# Altium project ARU8113 Testboard.PrjPcb (part 1 of 2)
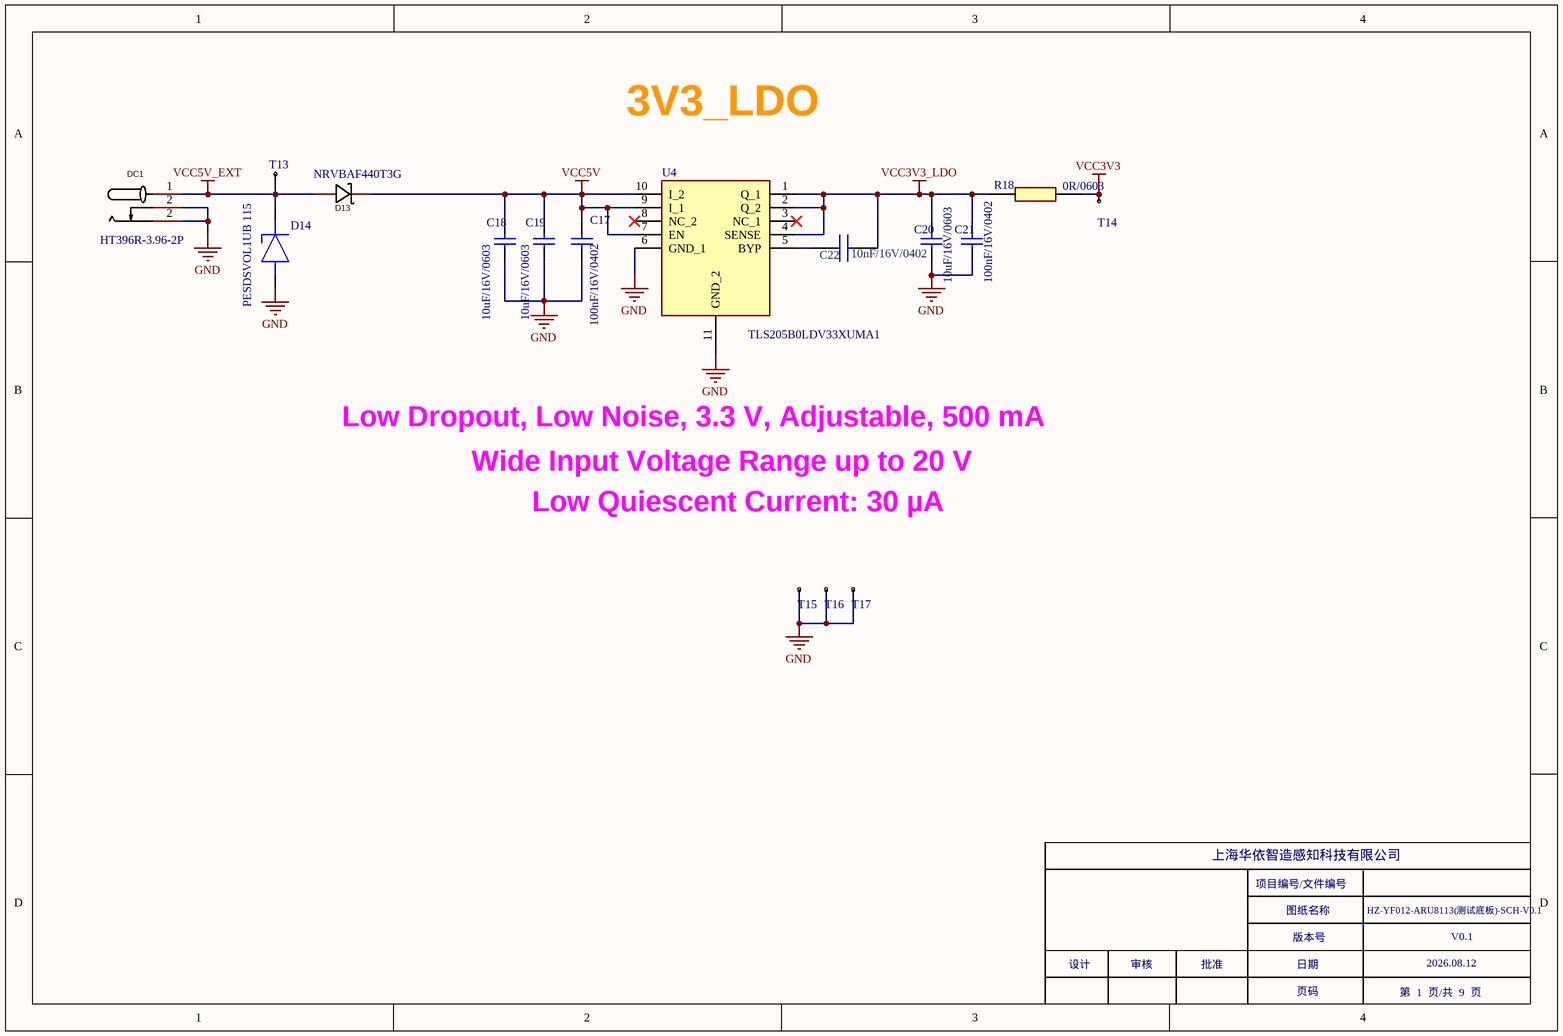
[diagram p0: 01_POWER .SchDoc]
9 sheets, 512 parts. Net scope: global (net labels, ports and power ports of the same name join across sheets).
Board files: ARU8113 Testboard_V0.1.PcbDoc, PCB2.PcbDoc
Sheets:
  01_POWER .SchDoc
  02_test1.SchDoc
  03_test2.SchDoc
  04_test3.SchDoc
  05_test4.SchDoc
  06_test5.SchDoc
  07_test6.SchDoc
  08_test7.SchDoc
  09_test8.SchDoc

## Sheet 01_POWER .SchDoc
size A4

### Parts
C17  100nF/16V/0402  [C 0402_L]
C18  10uF/16V/0603  [C 0603_L]
C19  10uF/16V/0603  [C 0603_L]
C20  10uF/16V/0603  [C 0603_L]
C21  100nF/16V/0402  [C 0402_L]
C22  10nF/16V/0402  [C 0402_L]
D13  NRVBAF440T3G  [SMA]
D14  PESDSVOL1UB 115  [SOD-523]
DC1  HT396R-3.96-2P  [HT396-3.96-2P]
R18  0R/0603  [R 0603_L]
T13  TEST  [TEST]  (value not drawn)
T14  TEST  [TEST]  (value not drawn)
T15  TEST  [TEST]  (value not drawn)
T16  TEST  [TEST]  (value not drawn)
T17  TEST  [TEST]  (value not drawn)
U4  TLS205B0LDV33XUMA1  [SON50P330X330X110-11N]

### Nets
GND: C17.2 C18.2 C19.2 C20.2 C21.2 D14.1 DC1.2 T15.1 T16.1 T17.1 U4.6(GND_1) U4.11(GND_2)
VCC3V3: R18.1 T14.1
VCC3V3_LDO: C20.1 C21.1 C22.1 R18.2 U4.1(Q_1) U4.2(Q_2) U4.4(SENSE)
VCC5V: C17.1 C18.1 C19.1 D13.2(K) U4.7(EN) U4.9(I_1) U4.10(I_2)
VCC5V_EXT: D13.1(A) D14.2 DC1.1 T13.1
NetC22_2: C22.2 U4.5(BYP)

Not connected (* = marked no-connect by the designer): U4 3(NC_1)* 8(NC_2)*

### Notes on the sheet
- 3V3_LDO
- Low Dropout, Low Noise, 3.3 V, Adjustable, 500 mA
- Wide Input Voltage Range up to 20 V
- Low Quiescent Current: 30 µA
- 上海华依智造感知科技有限公司
- 项目编号/文件编号
- 图纸名称
- HZ-YF012-ARU8113(测试底板)-SCH-V0.1
- 设计
- 审核
- 批准
- 版本号
- 日期
- 2026.08.12
- V0.1
- 页码
- 第  1  页/共  9  页

### Library data of the parts
C17 C21 = Cap: SMD/SMT 10UF 16V 20% 0603; Value: 10uF/16V; Published: 8-Jun-2000; LatestRevisionDate: 17-Jul-2002; LatestRevisionNote: Re-released for DXP Platform.; PackageReference: RAD-0.3; Publisher: Altium Limited; PackageDescription: Radial Cap, Thru-Hole; 2 Leads; 0.3 in Pin Spacing
C18-C20 = Cap: SMD/SMT 10UF 16V 20% 0603; Published: 8-Jun-2000; LatestRevisionDate: 17-Jul-2002; LatestRevisionNote: Re-released for DXP Platform.; PackageReference: RAD-0.3; Publisher: Altium Limited; PackageDescription: Radial Cap, Thru-Hole; 2 Leads; 0.3 in Pin Spacing; Value: 10uF/16V
C22 = 0402Capacitor: Capacitor; Manufacturer_Name: Murata Electronics; Manufacturer_Part_Number: GCM155R71C104KA55D; Datasheet Link: https://componentsearchengine.com//GCM155R71C104KA55D.pdf; Height: 0.55mm; Mouser2 Part Number: 81-GCM155R71C104KA5D; Mouser2 Price/Stock: https://www.mouser.com/Search/Refine.aspx?Keyword=81-GCM155R71C104KA5D
D13 = SS14_C2480: Manufacturer: MDD; Symbol: SS14; Add into BOM: yes; Diode Configuration: 独立式; Forward Voltage (Vf@If): 550mV@1A; Reverse Voltage (Vr): 40V; Average Rectified Current (Io): 1A; Reverse Leakage Current (Ir): 500uA@40V; Device: SS14_C2480; Supplier: LCSC; Manufacturer Part: SS14; Supplier Part: C2480; JLCPCB Part Class: Basic Part; LCSC Part Name: 电压:40V 电流:1A; Supplier Footprint: SMA(DO-214AC); Datasheet: https://atta.szlcsc.com/upload/public/pdf/source/20230712/2DB6064CFBB99DE6DB116BEE8208BE66.pdf; Convert to PCB: yes
D14 = PESD5V0L1UB,115: Diode ESD (Uni-directional); Manufacturer_Name: Nexperia; Datasheet Link: https://assets.nexperia.com/documents/data-sheet/PESD5V0L1UB.pdf; Height: 0.65mm; Manufacturer_Part_Number: PESD5V0L1UB,115
DC1 = DC005: Manufacturer: SHOU HAN(首韩); Symbol: DC005_C431533; Add into BOM: yes; Connector Type: DC电源插座; Inside Contact Diameter: 2mm; Outside Contact Diameter: 6.3mm; Current Rating (Max): 500mA; Voltage Rating (Max): 30V; Device: DC005; LCSC Part Name: DC电源插座 内径:2mm 外径:6.3mm; Supplier Part: C431533; Manufacturer Part: DC005; Supplier Footprint: 插件; JLCPCB Part Class: Extended Part; Datasheet: https://atta.szlcsc.com/upload/public/pdf/source/20190925/C431533_4751811035784AC1D38EBC85F7905E99.pdf; Supplier: LCSC; Convert to PCB: yes; Mounting Style: 弯插; Operating Temperature Range: -40℃~+55℃
R18 = 0402Resistor: Resistor; Manufacturer_Name: KOA Speer; Manufacturer_Part_Number: RN73H1ETTP1002F50; Datasheet Link: https://www.mouser.fr/datasheet/2/219/RN73H-12200.pdf; Height: 0.4mm
U4 = TLS205B0LDV33XUMA1: Integrated Circuit; Manufacturer_Name: Infineon; Datasheet Link: https://www.mouser.de/datasheet/2/196/Infineon-TLS203B0-DS-v01_20-EN-1149982.pdf; Height: 1.1mm; Manufacturer_Part_Number: TLS205B0LDV33XUMA1; ComponentLink1Description: New link; ComponentLink1URL: *

## Sheet 02_test1.SchDoc
size A3; SheetNumber: 1; SheetTotal: 1
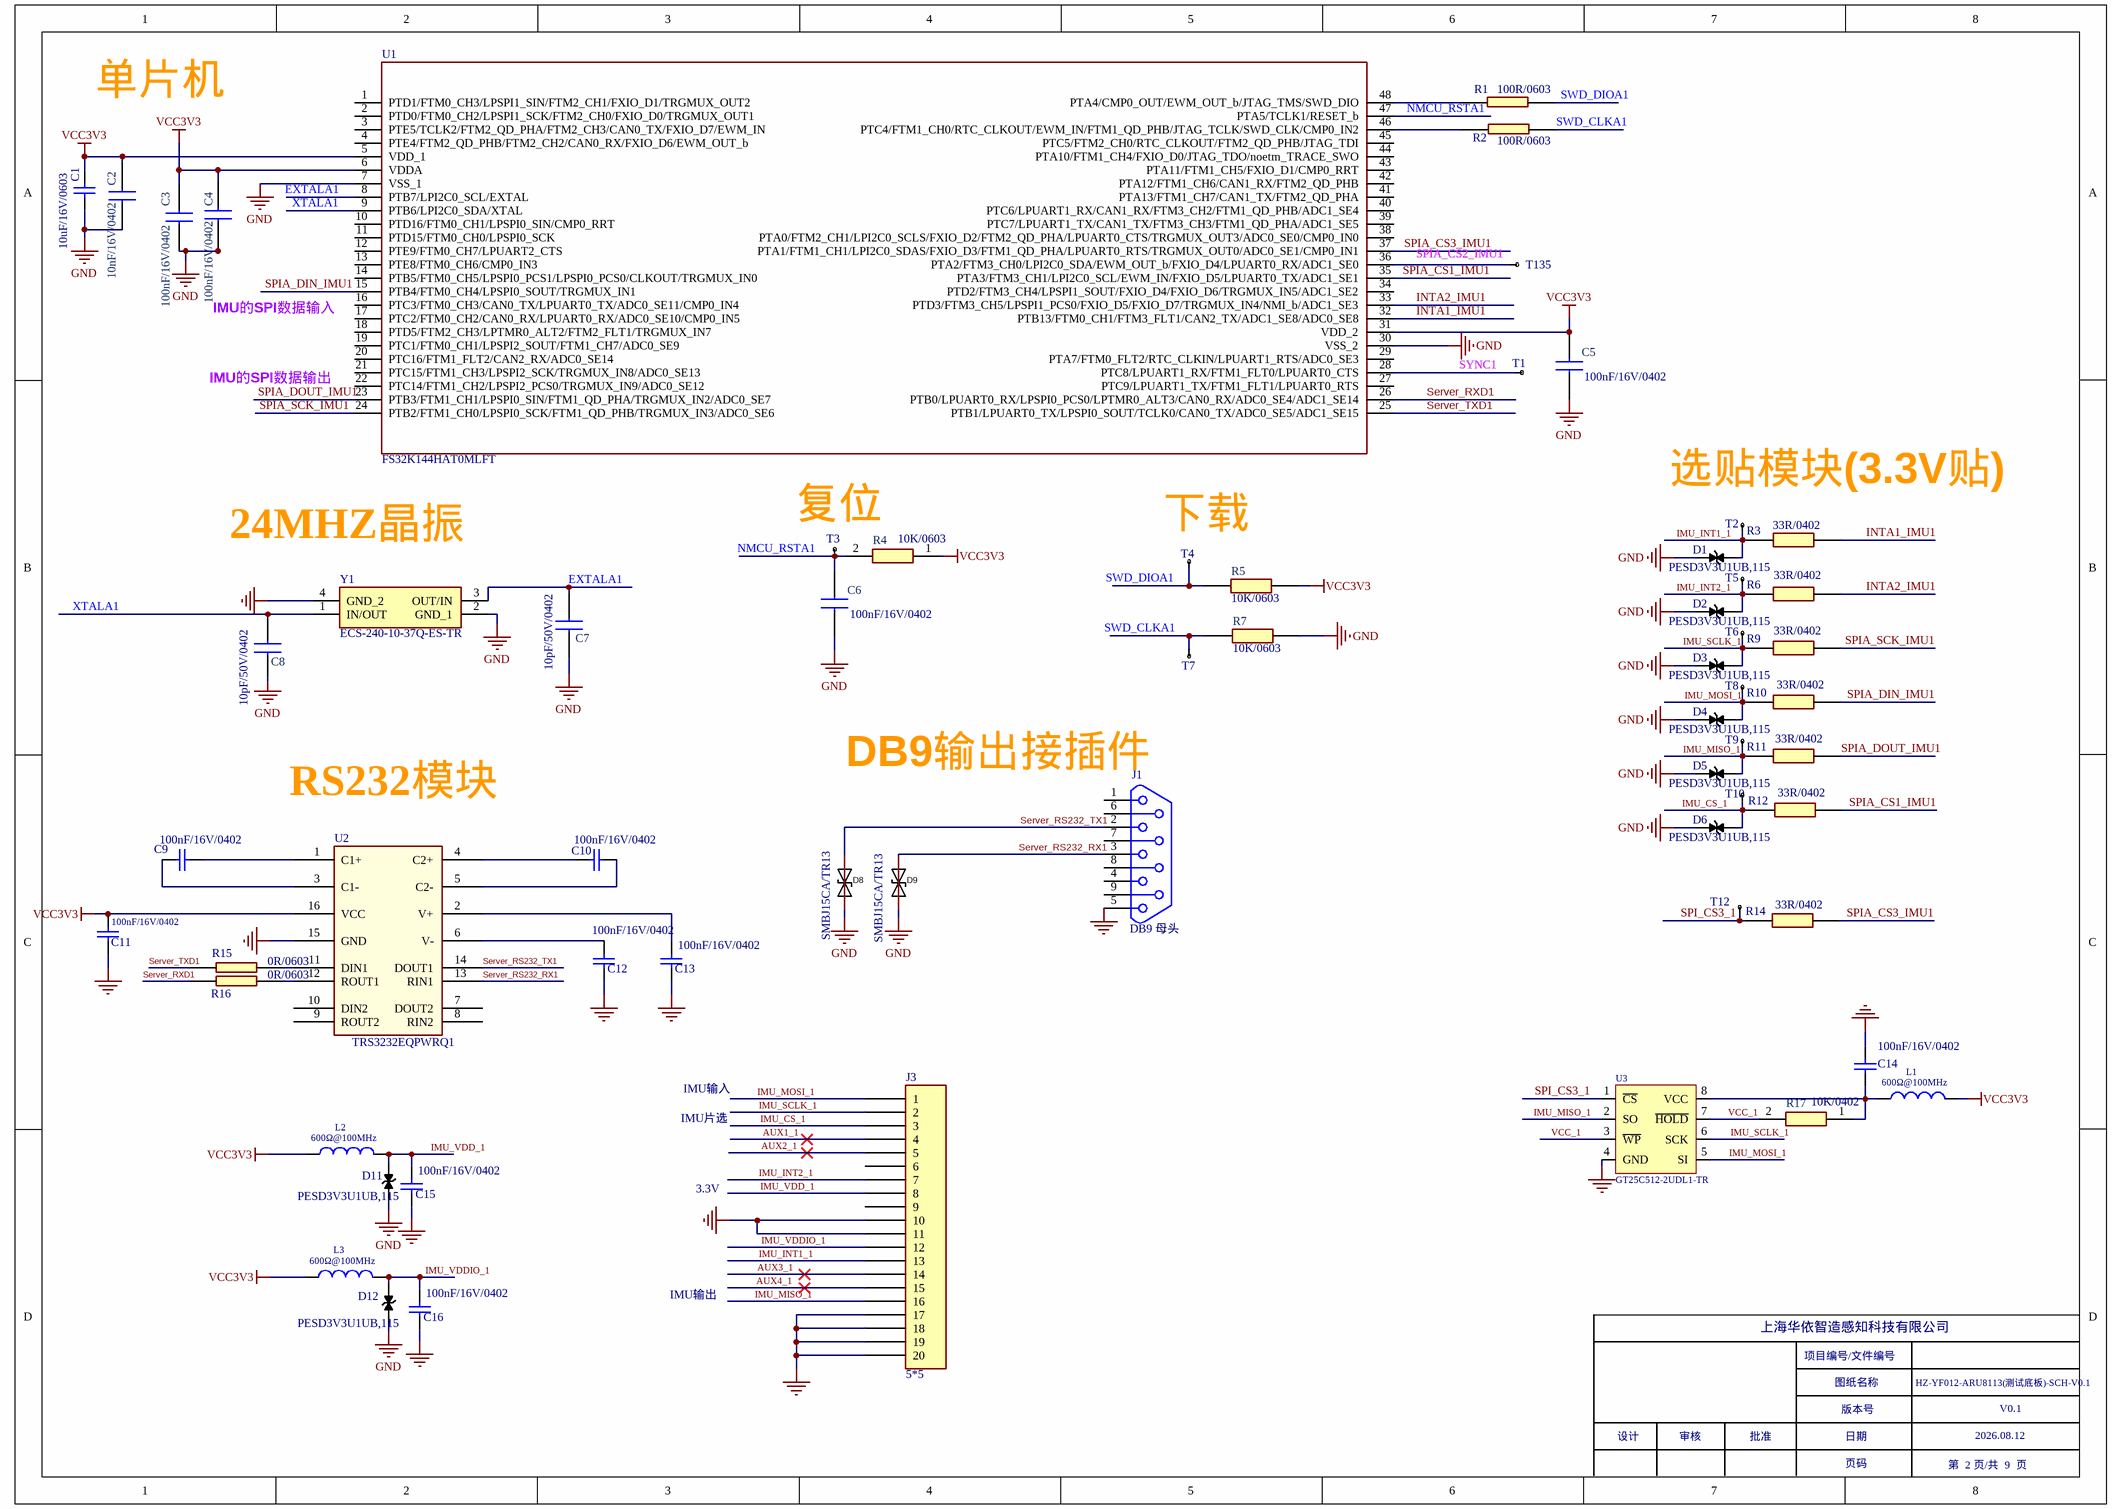
[diagram p1: 02_test1.SchDoc]

### Parts
C1  10uF/16V/0603  [C 0603_L]
C2  10nF/16V/0402  [C 0402_L]
C3  100nF/16V/0402  [C 0402_L]
C4  100nF/16V/0402  [C 0402_L]
C5  100nF/16V/0402  [C 0402_L]
C6  100nF/16V/0402  [C 0402_L]
C7  10pF/50V/0402  [C 0402_L]
C8  10pF/50V/0402  [C 0402_L]
C9  100nF/16V/0402  [C 0402_L]
C10  100nF/16V/0402  [C 0402_L]
C11  value 100nF/16V/0402  [C 0402_L]  (hidden comment: Cap)
C12  100nF/16V/0402  [C 0402_L]
C13  100nF/16V/0402  [C 0402_L]
C14  100nF/16V/0402  [C 0402_L]
C15  100nF/16V/0402  [C 0402_L]
C16  100nF/16V/0402  [0402C]
D1  PESD3V3U1UB,115  [SOD-523]
D2  PESD3V3U1UB,115  [SOD-523]
D3  PESD3V3U1UB,115  [SOD-523]
D4  PESD3V3U1UB,115  [SOD-523]
D5  PESD3V3U1UB,115  [SOD-523]
D6  PESD3V3U1UB,115  [SOD-523]
D8  SMBJ15CA/TR13  [SMB]
D9  SMBJ15CA/TR13  [SMB]
D11  PESD3V3U1UB,115  [PESD3V3U1UB,115]
D12  PESD3V3U1UB,115  [PESD3V3U1UB,115]
J1  DB9 母头  [DB9-RS8R1-2R77]
J3  5*5  [5*5-socket]
L1  value 600Ω@100MHz  [0603L]  (hidden comment: Inductor)
L2  value 600Ω@100MHz  [0603L]  (hidden comment: Inductor)
L3  value 600Ω@100MHz  [0603L]  (hidden comment: Inductor)
R1  100R/0603  [R 0603_L]
R2  100R/0603  [R 0603_L]
R3  33R/0402  [0402R]
R4  10K/0603  [R 0603_L]
R5  10K/0603  [R 0603_L]
R6  33R/0402  [0402R]
R7  10K/0603  [R 0603_L]
R9  33R/0402  [0402R]
R10  33R/0402  [0402R]
R11  33R/0402  [0402R]
R12  33R/0402  [0402R]
R14  33R/0402  [0402R]
R15  0R/0603  [R 0603_L]
R16  0R/0603  [R 0603_L]
R17  10K/0402  [0402R]
T1  TEST  [Test-0.5mm]  (value not drawn)
T2  TEST  [TEST]  (value not drawn)
T3  TEST  [TEST]  (value not drawn)
T4  TEST  [TEST]  (value not drawn)
T5  TEST  [TEST]  (value not drawn)
T6  TEST  [TEST]  (value not drawn)
T7  TEST  [TEST]  (value not drawn)
T8  TEST  [TEST]  (value not drawn)
T9  TEST  [TEST]  (value not drawn)
T10  TEST  [TEST]  (value not drawn)
T12  TEST  [Test-0.5mm]  (value not drawn)
T135  TEST  [Test-0.5mm]  (value not drawn)
U1  FS32K144HAT0MLFT  [LQFP48_7X7]
U2  TRS3232EQPWRQ1  [TSSOP16_640X500]
U3  GT25C512-2UDL1-TR  [GT25C512-2UDLA2-TR]
Y1  ECS-240-10-37Q-ES-TR  [ECS2401037QESTR]

### Nets
GND: C1.2 C2.1 C3.2 C4.2 C5.2 C6.2 C7.1 C8.1 C11.2 C12.2 C13.2 C14.1 C15.2 C16.2 D1.1 D2.1 D3.1 D4.1 D5.1 D6.1 D8.1 D9.1 D11.1 D12.1 J1.5 J3.10 J3.11 J3.17 J3.18 J3.19 J3.20 R7.1 U1.7(VSS_1) U1.30(VSS_2) U2.15(GND) U3.4(GND) Y1.2(GND_1) Y1.4(GND_2)
VCC3V3: C1.1 C2.2 C3.1 C4.1 C5.1 C11.1 L1.2 L2.1 L3.1 R4.1 R5.1 U1.5(VDD_1) U1.6(VDDA) U1.31(VDD_2) U2.16(VCC)
AUX1_1: J3.4
AUX2_1: J3.5
AUX3_1: J3.14
AUX4_1: J3.15
EXTALA1: C7.2 U1.8(PTB7/LPI2C0_SCL/EXTAL) Y1.3(OUT/IN)
IMU_CS_1: D6.2 J3.3 R12.2 T10.1
IMU_INT1_1: D1.2 J3.13 R3.2 T2.1
IMU_INT2_1: D2.2 J3.7 R6.2 T5.1
IMU_MISO_1: D5.2 J3.16 R11.2 T9.1 U3.2(SO)
IMU_MOSI_1: D4.2 J3.1 R10.2 T8.1 U3.5(SI)
IMU_SCLK_1: D3.2 J3.2 R9.2 T6.1 U3.6(SCK)
IMU_VDD_1: C15.1 D11.2 J3.8 L2.2
IMU_VDDIO_1: C16.1 D12.2 J3.12 L3.2
INTA1_IMU1: R3.1 U1.32(PTB13/FTM0_CH1/FTM3_FLT1/CAN2_TX/ADC1_SE8/ADC0_SE8)
INTA2_IMU1: R6.1 U1.33(PTD3/FTM3_CH5/LPSPI1_PCS0/FXIO_D5/FXIO_D7/TRGMUX_IN4/NMI_b/ADC1_SE3)
NMCU_RSTA1: C6.1 R4.2 T3.1 U1.47(PTA5/TCLK1/RESET_b)
Server_RS232_RX1: D9.2 J1.3 U2.13(RIN1)
Server_RS232_TX1: D8.2 J1.2 U2.14(DOUT1)
Server_RXD1: R16.1 U1.26(PTB0/LPUART0_RX/LPSPI0_PCS0/LPTMR0_ALT3/CAN0_RX/ADC0_SE4/ADC1_SE14)
Server_TXD1: R15.1 U1.25(PTB1/LPUART0_TX/LPSPI0_SOUT/TCLK0/CAN0_TX/ADC0_SE5/ADC1_SE15)
SPI_CS3_1: R14.2 T12.1 U3.1(~{CS})
SPIA_CS1_IMU1: R12.1 U1.35(PTA3/FTM3_CH1/LPI2C0_SCL/EWM_IN/FXIO_D5/LPUART0_TX/ADC1_SE1)
SPIA_CS3_IMU1: R14.1 U1.37(PTA1/FTM1_CH1/LPI2C0_SDAS/FXIO_D3/FTM1_QD_PHA/LPUART0_RTS/TRGMUX_OUT0/ADC0_SE1/CMP0_IN1)
SPIA_DIN_IMU1: R10.1 U1.15(PTB4/FTM0_CH4/LPSPI0_SOUT/TRGMUX_IN1)
SPIA_DOUT_IMU1: R11.1 U1.23(PTB3/FTM1_CH1/LPSPI0_SIN/FTM1_QD_PHA/TRGMUX_IN2/ADC0_SE7)
SPIA_SCK_IMU1: R9.1 U1.24(PTB2/FTM1_CH0/LPSPI0_SCK/FTM1_QD_PHB/TRGMUX_IN3/ADC0_SE6)
SWD_CLKA1: R2.2 R7.2 T7.1
SWD_DIOA1: R1.2 R5.2 T4.1
SYNC1: T1.1 U1.28(PTC8/LPUART1_RX/FTM1_FLT0/LPUART0_CTS)
VCC_1: R17.2 U3.3(~{WP}) U3.7(~{HOLD})
XTALA1: C8.2 U1.9(PTB6/LPI2C0_SDA/XTAL) Y1.1(IN/OUT)
NetC9_1: C9.1 U2.3(C1-)
NetC9_2: C9.2 U2.1(C1+)
NetC10_1: C10.1 U2.4(C2+)
NetC10_2: C10.2 U2.5(C2-)
NetC12_1: C12.1 U2.6(V-)
NetC13_1: C13.1 U2.2(V+)
NetC14_2: C14.2 L1.1 R17.1 U3.8(VCC)
NetR1_1: R1.1 U1.48(PTA4/CMP0_OUT/EWM_OUT_b/JTAG_TMS/SWD_DIO)
NetR2_1: R2.1 U1.46(PTC4/FTM1_CH0/RTC_CLKOUT/EWM_IN/FTM1_QD_PHB/JTAG_TCLK/SWD_CLK/CMP0_IN2)
NetR15_2: R15.2 U2.11(DIN1)
NetR16_2: R16.2 U2.12(ROUT1)
NetT135_1: T135.1 U1.36(PTA2/FTM3_CH0/LPI2C0_SDA/EWM_OUT_b/FXIO_D4/LPUART0_RX/ADC1_SE0)

Not connected (* = marked no-connect by the designer): J1 1 4 6 7 8 9; J3 6 9; U1 1(PTD1/FTM0_CH3/LPSPI1_SIN/FTM2_CH1/FXIO_D1/TRGMUX_OUT2) 2(PTD0/FTM0_CH2/LPSPI1_SCK/FTM2_CH0/FXIO_D0/TRGMUX_OUT1) 3(PTE5/TCLK2/FTM2_QD_PHA/FTM2_CH3/CAN0_TX/FXIO_D7/EWM_IN) 4(PTE4/FTM2_QD_PHB/FTM2_CH2/CAN0_RX/FXIO_D6/EWM_OUT_b) 10(PTD16/FTM0_CH1/LPSPI0_SIN/CMP0_RRT) 11(PTD15/FTM0_CH0/LPSPI0_SCK) 12(PTE9/FTM0_CH7/LPUART2_CTS) 13(PTE8/FTM0_CH6/CMP0_IN3) 14(PTB5/FTM0_CH5/LPSPI0_PCS1/LPSPI0_PCS0/CLKOUT/TRGMUX_IN0) 16(PTC3/FTM0_CH3/CAN0_TX/LPUART0_TX/ADC0_SE11/CMP0_IN4) 17(PTC2/FTM0_CH2/CAN0_RX/LPUART0_RX/ADC0_SE10/CMP0_IN5) 18(PTD5/FTM2_CH3/LPTMR0_ALT2/FTM2_FLT1/TRGMUX_IN7) 19(PTC1/FTM0_CH1/LPSPI2_SOUT/FTM1_CH7/ADC0_SE9) 20(PTC16/FTM1_FLT2/CAN2_RX/ADC0_SE14) 21(PTC15/FTM1_CH3/LPSPI2_SCK/TRGMUX_IN8/ADC0_SE13) 22(PTC14/FTM1_CH2/LPSPI2_PCS0/TRGMUX_IN9/ADC0_SE12) 27(PTC9/LPUART1_TX/FTM1_FLT1/LPUART0_RTS) 29(PTA7/FTM0_FLT2/RTC_CLKIN/LPUART1_RTS/ADC0_SE3) 34(PTD2/FTM3_CH4/LPSPI1_SOUT/FXIO_D4/FXIO_D6/TRGMUX_IN5/ADC1_SE2) 38(PTA0/FTM2_CH1/LPI2C0_SCLS/FXIO_D2/FTM2_QD_PHA/LPUART0_CTS/TRGMUX_OUT3/ADC0_SE0/CMP0_IN0) 39(PTC7/LPUART1_TX/CAN1_TX/FTM3_CH3/FTM1_QD_PHA/ADC1_SE5) 40(PTC6/LPUART1_RX/CAN1_RX/FTM3_CH2/FTM1_QD_PHB/ADC1_SE4) 41(PTA13/FTM1_CH7/CAN1_TX/FTM2_QD_PHA) 42(PTA12/FTM1_CH6/CAN1_RX/FTM2_QD_PHB) 43(PTA11/FTM1_CH5/FXIO_D1/CMP0_RRT) 44(PTA10/FTM1_CH4/FXIO_D0/JTAG_TDO/noetm_TRACE_SWO) 45(PTC5/FTM2_CH0/RTC_CLKOUT/FTM2_QD_PHB/JTAG_TDI); U2 7(DOUT2) 8(RIN2) 9(ROUT2) 10(DIN2)

### Notes on the sheet
- 单片机
- IMU的SPI数据输入
- IMU的SPI数据输出
- 选贴模块(3.3V贴)
- (near Y1) 24MHZ晶振
- (near T3) 复位
- (near T4) 下载
- DB9输出接插件
- (near U2) RS232模块
- IMU片选
- IMU输入
- 3.3V
- IMU输出
- 上海华依智造感知科技有限公司
- 项目编号/文件编号
- 图纸名称
- HZ-YF012-ARU8113(测试底板)-SCH-V0.1
- 设计
- 审核
- 批准
- 版本号
- 日期
- 2026.08.12
- V0.1
- 页码
- 第  2 页/共  9  页
- Labels drawn without touching a wire or pin: SPIA_CS2_IMU1

### Library data of the parts
C1 = Cap: SMD/SMT 10UF 16V 20% 0603; Published: 8-Jun-2000; LatestRevisionDate: 17-Jul-2002; LatestRevisionNote: Re-released for DXP Platform.; PackageReference: RAD-0.3; Publisher: Altium Limited; PackageDescription: Radial Cap, Thru-Hole; 2 Leads; 0.3 in Pin Spacing; Value: 10uF/16V
C2-C8 = 0402Capacitor: as C22 on sheet 01_POWER ; Datasheet Link: https://componentsearchengine.com//GCM155R71C104KA55D.pdf; Height: 0.55mm; Mouser2 Part Number: 81-GCM155R71C104KA5D; Mouser2 Price/Stock: https://www.mouser.com/Search/Refine.aspx?Keyword=81-GCM155R71C104KA5D
C9-C16 = Cap: '100nF/16V/10%/ 0402/X7R / -55℃ ～ 125℃/AEC-Q200; Published: 8-Jun-2000; LatestRevisionDate: 17-Jul-2002; LatestRevisionNote: Re-released for DXP Platform.; PackageReference: RAD-0.3; Publisher: Altium Limited; PackageDescription: Radial Cap, Thru-Hole; 2 Leads; 0.3 in Pin Spacing
  C9 C10 C12-C16: Value: 100nF/16V/0402
D1-D6 D11 D12 = SMBJ36CA: 双向TVS管；600W表面贴装瞬态电压抑制器,工作电压36V，SMB_DO-214AA封装 DIODES
D8 D9 = SMBJ15CA/TR13_C78410: Manufacturer: Brightking(君耀电子); Symbol: SMBJ15CA-C78410; Add into BOM: yes; polarity: 双向; Reverse Stand-Off Voltage (Vrwm): 15V; Maximum Clamping Voltage: 24.4V; Peak Pulse Current (Ipp)@10/1000us: 24.6A; Peak Pulse Power Dissipation (Ppp)@10/1000us: 600W; Breakdown Voltage: 16.7V; Type: TVS; Device: SMBJ15CA/TR13_C78410; LCSC Part Name: 双向 15V截止 24.6A峰值脉冲; Supplier Part: C78410; Manufacturer Part: SMBJ15CA/TR13; Supplier Footprint: SMB(DO-214AA); JLCPCB Part Class: Extended Part; Datasheet: https://atta.szlcsc.com/upload/public/pdf/source/20181127/C309995_EB3DFB9F9AEE5D2146ECD9FA5992A402.pdf; Supplier: LCSC; Convert to PCB: yes
J1 = DB9
L1-L3 = Inductor: Code_IEC: 1005; Published: 8-Jun-2000; LatestRevisionDate: 29-May-2009; LatestRevisionNote: IPC-7351 Footprint Added.; PackageReference: 0402-A; Publisher: Altium Limited; PackageDescription: Chip Inductor; Code_JEITA: 0402
R1 R2 R15 R16 = 0402
R3-R7 R9-R12 R14 R17 = 0402Resistor: as R18 on sheet 01_POWER ; Datasheet Link: https://www.mouser.fr/datasheet/2/219/RN73H-12200.pdf; Height: 0.4mm
U1 = FS32K144HAT0MLFT: Integrated Circuit; Manufacturer_Name: NXP; Datasheet Link: http://www.nxp.com/docs/en/data-sheet/S32K-DS.pdf; Height: 1.6mm; Manufacturer_Part_Number: FS32K144HAT0MLFT
U3 = GT25C512-2UDLA2-TR
Y1 = ECS-240-10-37Q-ES-TR: Crystal or Oscillator; Manufacturer_Name: ECS; Datasheet Link: https://www.ecsxtal.com/store/pdf/ECX-1637Q.pdf; Height: 0.55mm; Manufacturer_Part_Number: ECS-240-10-37Q-ES-TR

## Sheet 03_test2.SchDoc
size A3
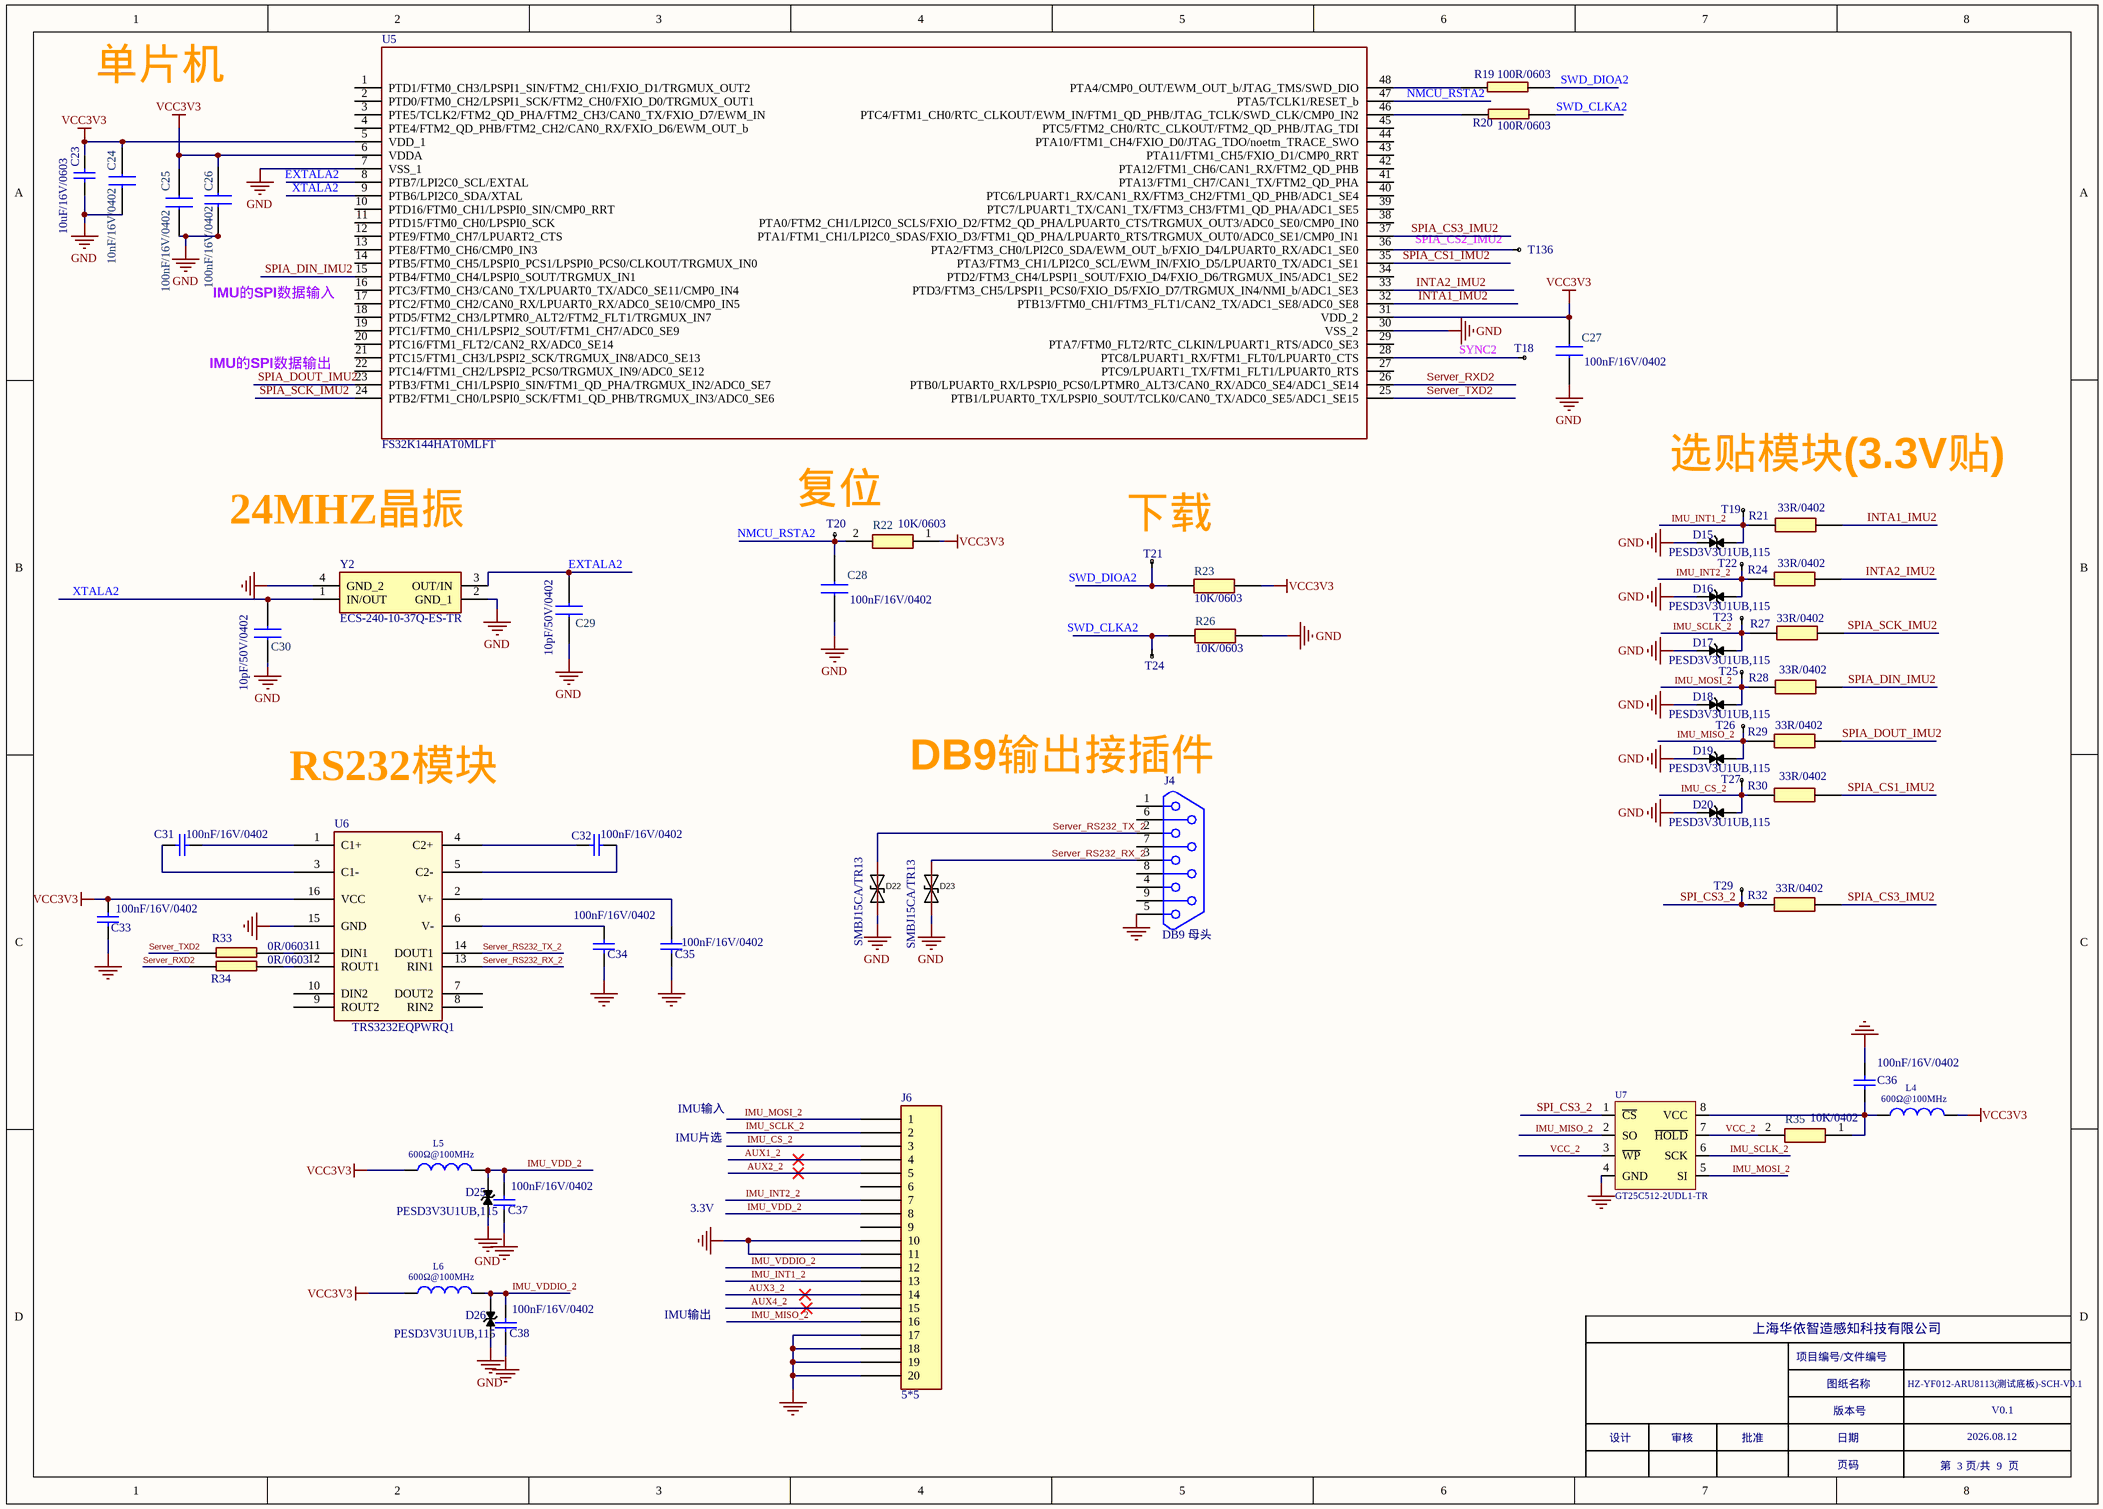
[diagram p2: 03_test2.SchDoc]

### Parts
C23  10uF/16V/0603  [C 0603_L]
C24  10nF/16V/0402  [C 0402_L]
C25  100nF/16V/0402  [C 0402_L]
C26  100nF/16V/0402  [C 0402_L]
C27  100nF/16V/0402  [C 0402_L]
C28  100nF/16V/0402  [C 0402_L]
C29  10pF/50V/0402  [C 0402_L]
C30  10pF/50V/0402  [C 0402_L]
C31  100nF/16V/0402  [C 0402_L]
C32  100nF/16V/0402  [C 0402_L]
C33  100nF/16V/0402  [C 0402_L]
C34  100nF/16V/0402  [C 0402_L]
C35  100nF/16V/0402  [C 0402_L]
C36  100nF/16V/0402  [0402C]
C37  100nF/16V/0402  [0402C]
C38  100nF/16V/0402  [C 0402_L]
D15  PESD3V3U1UB,115  [SOD-523]
D16  PESD3V3U1UB,115  [SOD-523]
D17  PESD3V3U1UB,115  [SOD-523]
D18  PESD3V3U1UB,115  [SOD-523]
D19  PESD3V3U1UB,115  [SOD-523]
D20  PESD3V3U1UB,115  [SOD-523]
D22  SMBJ15CA/TR13  [SMB]
D23  SMBJ15CA/TR13  [SMB]
D25  PESD3V3U1UB,115  [PESD3V3U1UB,115]
D26  PESD3V3U1UB,115  [PESD3V3U1UB,115]
J4  DB9 母头  [DB9-RS8R1-2R77]
J6  5*5  [5*5-socket]
L4  value 600Ω@100MHz  [0603L]  (hidden comment: Inductor)
L5  value 600Ω@100MHz  [0603L]  (hidden comment: Inductor)
L6  value 600Ω@100MHz  [0603L]  (hidden comment: Inductor)
R19  100R/0603  [R 0603_L]
R20  100R/0603  [R 0603_L]
R21  33R/0402  [0402R]
R22  10K/0603  [R 0603_L]
R23  10K/0603  [R 0603_L]
R24  33R/0402  [0402R]
R26  10K/0603  [0603R]
R27  33R/0402  [0402R]
R28  33R/0402  [0402R]
R29  33R/0402  [0402R]
R30  33R/0402  [0402R]
R32  33R/0402  [0402R]
R33  0R/0603  [R 0603_L]
R34  0R/0603  [R 0603_L]
R35  10K/0402  [0402R]
T18  TEST  [Test-0.5mm]  (value not drawn)
T19  TEST  [TEST]  (value not drawn)
T20  TEST  [TEST]  (value not drawn)
T21  TEST  [TEST]  (value not drawn)
T22  TEST  [TEST]  (value not drawn)
T23  TEST  [TEST]  (value not drawn)
T24  TEST  [TEST]  (value not drawn)
T25  TEST  [TEST]  (value not drawn)
T26  TEST  [TEST]  (value not drawn)
T27  TEST  [TEST]  (value not drawn)
T29  TEST  [Test-0.5mm]  (value not drawn)
T136  TEST  [Test-0.5mm]  (value not drawn)
U5  FS32K144HAT0MLFT  [LQFP48_7X7]
U6  TRS3232EQPWRQ1  [TSSOP16_640X500]
U7  GT25C512-2UDL1-TR  [GT25C512-2UDLA2-TR]
Y2  ECS-240-10-37Q-ES-TR  [ECS2401037QESTR]

### Nets
GND: C23.2 C24.1 C25.2 C26.2 C27.2 C28.2 C29.1 C30.1 C33.2 C34.2 C35.2 C36.1 C37.2 C38.2 D15.1 D16.1 D17.1 D18.1 D19.1 D20.1 D22.1 D23.1 D25.1 D26.1 J4.5 J6.10 J6.11 J6.17 J6.18 J6.19 J6.20 R26.1 U5.7(VSS_1) U5.30(VSS_2) U6.15(GND) U7.4(GND) Y2.2(GND_1) Y2.4(GND_2)
VCC3V3: C23.1 C24.2 C25.1 C26.1 C27.1 C33.1 L4.2 L5.1 L6.1 R22.1 R23.1 U5.5(VDD_1) U5.6(VDDA) U5.31(VDD_2) U6.16(VCC)
AUX1_2: J6.4
AUX2_2: J6.5
AUX3_2: J6.14
AUX4_2: J6.15
EXTALA2: C29.2 U5.8(PTB7/LPI2C0_SCL/EXTAL) Y2.3(OUT/IN)
IMU_CS_2: D20.2 J6.3 R30.2 T27.1
IMU_INT1_2: D15.2 J6.13 R21.2 T19.1
IMU_INT2_2: D16.2 J6.7 R24.2 T22.1
IMU_MISO_2: D19.2 J6.16 R29.2 T26.1 U7.2(SO)
IMU_MOSI_2: D18.2 J6.1 R28.2 T25.1 U7.5(SI)
IMU_SCLK_2: D17.2 J6.2 R27.2 T23.1 U7.6(SCK)
IMU_VDD_2: C37.1 D25.2 J6.8 L5.2
IMU_VDDIO_2: C38.1 D26.2 J6.12 L6.2
INTA1_IMU2: R21.1 U5.32(PTB13/FTM0_CH1/FTM3_FLT1/CAN2_TX/ADC1_SE8/ADC0_SE8)
INTA2_IMU2: R24.1 U5.33(PTD3/FTM3_CH5/LPSPI1_PCS0/FXIO_D5/FXIO_D7/TRGMUX_IN4/NMI_b/ADC1_SE3)
NMCU_RSTA2: C28.1 R22.2 T20.1 U5.47(PTA5/TCLK1/RESET_b)
Server_RS232_RX_2: D23.2 J4.3 U6.13(RIN1)
Server_RS232_TX_2: D22.2 J4.2 U6.14(DOUT1)
Server_RXD2: R34.1 U5.26(PTB0/LPUART0_RX/LPSPI0_PCS0/LPTMR0_ALT3/CAN0_RX/ADC0_SE4/ADC1_SE14)
Server_TXD2: R33.1 U5.25(PTB1/LPUART0_TX/LPSPI0_SOUT/TCLK0/CAN0_TX/ADC0_SE5/ADC1_SE15)
SPI_CS3_2: R32.2 T29.1 U7.1(~{CS})
SPIA_CS1_IMU2: R30.1 U5.35(PTA3/FTM3_CH1/LPI2C0_SCL/EWM_IN/FXIO_D5/LPUART0_TX/ADC1_SE1)
SPIA_CS3_IMU2: R32.1 U5.37(PTA1/FTM1_CH1/LPI2C0_SDAS/FXIO_D3/FTM1_QD_PHA/LPUART0_RTS/TRGMUX_OUT0/ADC0_SE1/CMP0_IN1)
SPIA_DIN_IMU2: R28.1 U5.15(PTB4/FTM0_CH4/LPSPI0_SOUT/TRGMUX_IN1)
SPIA_DOUT_IMU2: R29.1 U5.23(PTB3/FTM1_CH1/LPSPI0_SIN/FTM1_QD_PHA/TRGMUX_IN2/ADC0_SE7)
SPIA_SCK_IMU2: R27.1 U5.24(PTB2/FTM1_CH0/LPSPI0_SCK/FTM1_QD_PHB/TRGMUX_IN3/ADC0_SE6)
SWD_CLKA2: R20.2 R26.2 T24.1
SWD_DIOA2: R19.2 R23.2 T21.1
SYNC2: T18.1 U5.28(PTC8/LPUART1_RX/FTM1_FLT0/LPUART0_CTS)
VCC_2: R35.2 U7.3(~{WP}) U7.7(~{HOLD})
XTALA2: C30.2 U5.9(PTB6/LPI2C0_SDA/XTAL) Y2.1(IN/OUT)
NetC31_1: C31.1 U6.3(C1-)
NetC31_2: C31.2 U6.1(C1+)
NetC32_1: C32.1 U6.4(C2+)
NetC32_2: C32.2 U6.5(C2-)
NetC34_1: C34.1 U6.6(V-)
NetC35_1: C35.1 U6.2(V+)
NetC36_2: C36.2 L4.1 R35.1 U7.8(VCC)
NetR19_1: R19.1 U5.48(PTA4/CMP0_OUT/EWM_OUT_b/JTAG_TMS/SWD_DIO)
NetR20_1: R20.1 U5.46(PTC4/FTM1_CH0/RTC_CLKOUT/EWM_IN/FTM1_QD_PHB/JTAG_TCLK/SWD_CLK/CMP0_IN2)
NetR33_2: R33.2 U6.11(DIN1)
NetR34_2: R34.2 U6.12(ROUT1)
NetT136_1: T136.1 U5.36(PTA2/FTM3_CH0/LPI2C0_SDA/EWM_OUT_b/FXIO_D4/LPUART0_RX/ADC1_SE0)

Not connected (* = marked no-connect by the designer): J4 1 4 6 7 8 9; J6 6 9; U5 1(PTD1/FTM0_CH3/LPSPI1_SIN/FTM2_CH1/FXIO_D1/TRGMUX_OUT2) 2(PTD0/FTM0_CH2/LPSPI1_SCK/FTM2_CH0/FXIO_D0/TRGMUX_OUT1) 3(PTE5/TCLK2/FTM2_QD_PHA/FTM2_CH3/CAN0_TX/FXIO_D7/EWM_IN) 4(PTE4/FTM2_QD_PHB/FTM2_CH2/CAN0_RX/FXIO_D6/EWM_OUT_b) 10(PTD16/FTM0_CH1/LPSPI0_SIN/CMP0_RRT) 11(PTD15/FTM0_CH0/LPSPI0_SCK) 12(PTE9/FTM0_CH7/LPUART2_CTS) 13(PTE8/FTM0_CH6/CMP0_IN3) 14(PTB5/FTM0_CH5/LPSPI0_PCS1/LPSPI0_PCS0/CLKOUT/TRGMUX_IN0) 16(PTC3/FTM0_CH3/CAN0_TX/LPUART0_TX/ADC0_SE11/CMP0_IN4) 17(PTC2/FTM0_CH2/CAN0_RX/LPUART0_RX/ADC0_SE10/CMP0_IN5) 18(PTD5/FTM2_CH3/LPTMR0_ALT2/FTM2_FLT1/TRGMUX_IN7) 19(PTC1/FTM0_CH1/LPSPI2_SOUT/FTM1_CH7/ADC0_SE9) 20(PTC16/FTM1_FLT2/CAN2_RX/ADC0_SE14) 21(PTC15/FTM1_CH3/LPSPI2_SCK/TRGMUX_IN8/ADC0_SE13) 22(PTC14/FTM1_CH2/LPSPI2_PCS0/TRGMUX_IN9/ADC0_SE12) 27(PTC9/LPUART1_TX/FTM1_FLT1/LPUART0_RTS) 29(PTA7/FTM0_FLT2/RTC_CLKIN/LPUART1_RTS/ADC0_SE3) 34(PTD2/FTM3_CH4/LPSPI1_SOUT/FXIO_D4/FXIO_D6/TRGMUX_IN5/ADC1_SE2) 38(PTA0/FTM2_CH1/LPI2C0_SCLS/FXIO_D2/FTM2_QD_PHA/LPUART0_CTS/TRGMUX_OUT3/ADC0_SE0/CMP0_IN0) 39(PTC7/LPUART1_TX/CAN1_TX/FTM3_CH3/FTM1_QD_PHA/ADC1_SE5) 40(PTC6/LPUART1_RX/CAN1_RX/FTM3_CH2/FTM1_QD_PHB/ADC1_SE4) 41(PTA13/FTM1_CH7/CAN1_TX/FTM2_QD_PHA) 42(PTA12/FTM1_CH6/CAN1_RX/FTM2_QD_PHB) 43(PTA11/FTM1_CH5/FXIO_D1/CMP0_RRT) 44(PTA10/FTM1_CH4/FXIO_D0/JTAG_TDO/noetm_TRACE_SWO) 45(PTC5/FTM2_CH0/RTC_CLKOUT/FTM2_QD_PHB/JTAG_TDI); U6 7(DOUT2) 8(RIN2) 9(ROUT2) 10(DIN2)

### Notes on the sheet
- 单片机
- IMU的SPI数据输入
- IMU的SPI数据输出
- (near T20) 复位
- 选贴模块(3.3V贴)
- (near Y2) 24MHZ晶振
- (near T21) 下载
- (near U6) RS232模块
- DB9输出接插件
- IMU输入
- IMU片选
- 3.3V
- IMU输出
- 上海华依智造感知科技有限公司
- 项目编号/文件编号
- 图纸名称
- HZ-YF012-ARU8113(测试底板)-SCH-V0.1
- 设计
- 审核
- 批准
- 版本号
- 日期
- 2026.08.12
- V0.1
- 页码
- 第  3 页/共  9  页
- Labels drawn without touching a wire or pin: SPIA_CS2_IMU2

### Library data of the parts
C23 = Cap: SMD/SMT 10UF 16V 20% 0603; Published: 8-Jun-2000; LatestRevisionDate: 17-Jul-2002; LatestRevisionNote: Re-released for DXP Platform.; PackageReference: RAD-0.3; Publisher: Altium Limited; PackageDescription: Radial Cap, Thru-Hole; 2 Leads; 0.3 in Pin Spacing; Value: 10uF/16V
C24-C30 = 0402Capacitor: as C22 on sheet 01_POWER ; Datasheet Link: https://componentsearchengine.com//GCM155R71C104KA55D.pdf; Height: 0.55mm; Mouser2 Part Number: 81-GCM155R71C104KA5D; Mouser2 Price/Stock: https://www.mouser.com/Search/Refine.aspx?Keyword=81-GCM155R71C104KA5D
C31-C35 = Cap: '100nF/16V/10%/ 0402/X7R / -55℃ ～ 125℃/AEC-Q200; Value: 100nF/16V/0603; Published: 8-Jun-2000; LatestRevisionDate: 17-Jul-2002; LatestRevisionNote: Re-released for DXP Platform.; PackageReference: RAD-0.3; Publisher: Altium Limited; PackageDescription: Radial Cap, Thru-Hole; 2 Leads; 0.3 in Pin Spacing
C36-C38 = Cap: as C9 on sheet 02_test1; Published: 8-Jun-2000; LatestRevisionDate: 17-Jul-2002; LatestRevisionNote: Re-released for DXP Platform.; PackageReference: RAD-0.3; Publisher: Altium Limited; PackageDescription: Radial Cap, Thru-Hole; 2 Leads; 0.3 in Pin Spacing; Value: 100nF/16V/0402
D15-D20 D25 D26 = SMBJ36CA: as D1 on sheet 02_test1
D22 D23 = SMBJ15CA/TR13_C78410: as D8 on sheet 02_test1; Device: SMBJ15CA/TR13_C78410; LCSC Part Name: 双向 15V截止 24.6A峰值脉冲; Supplier Part: C78410; Manufacturer Part: SMBJ15CA/TR13; Supplier Footprint: SMB(DO-214AA); JLCPCB Part Class: Extended Part; Datasheet: https://atta.szlcsc.com/upload/public/pdf/source/20181127/C309995_EB3DFB9F9AEE5D2146ECD9FA5992A402.pdf; Supplier: LCSC; Convert to PCB: yes
J4 = DB9
L4-L6 = Inductor: Code_IEC: 1005; Published: 8-Jun-2000; LatestRevisionDate: 29-May-2009; LatestRevisionNote: IPC-7351 Footprint Added.; PackageReference: 0402-A; Publisher: Altium Limited; PackageDescription: Chip Inductor; Code_JEITA: 0402
R19 R20 R33 R34 = 0402
R21-R24 R26-R30 R32 R35 = 0402Resistor: as R18 on sheet 01_POWER ; Datasheet Link: https://www.mouser.fr/datasheet/2/219/RN73H-12200.pdf; Height: 0.4mm
U5 = FS32K144HAT0MLFT: as U1 on sheet 02_test1; Datasheet Link: http://www.nxp.com/docs/en/data-sheet/S32K-DS.pdf; Height: 1.6mm; Manufacturer_Part_Number: FS32K144HAT0MLFT
U7 = GT25C512-2UDLA2-TR
Y2 = ECS-240-10-37Q-ES-TR: as Y1 on sheet 02_test1; Datasheet Link: https://www.ecsxtal.com/store/pdf/ECX-1637Q.pdf; Height: 0.55mm; Manufacturer_Part_Number: ECS-240-10-37Q-ES-TR

## Sheet 04_test3.SchDoc
size A3
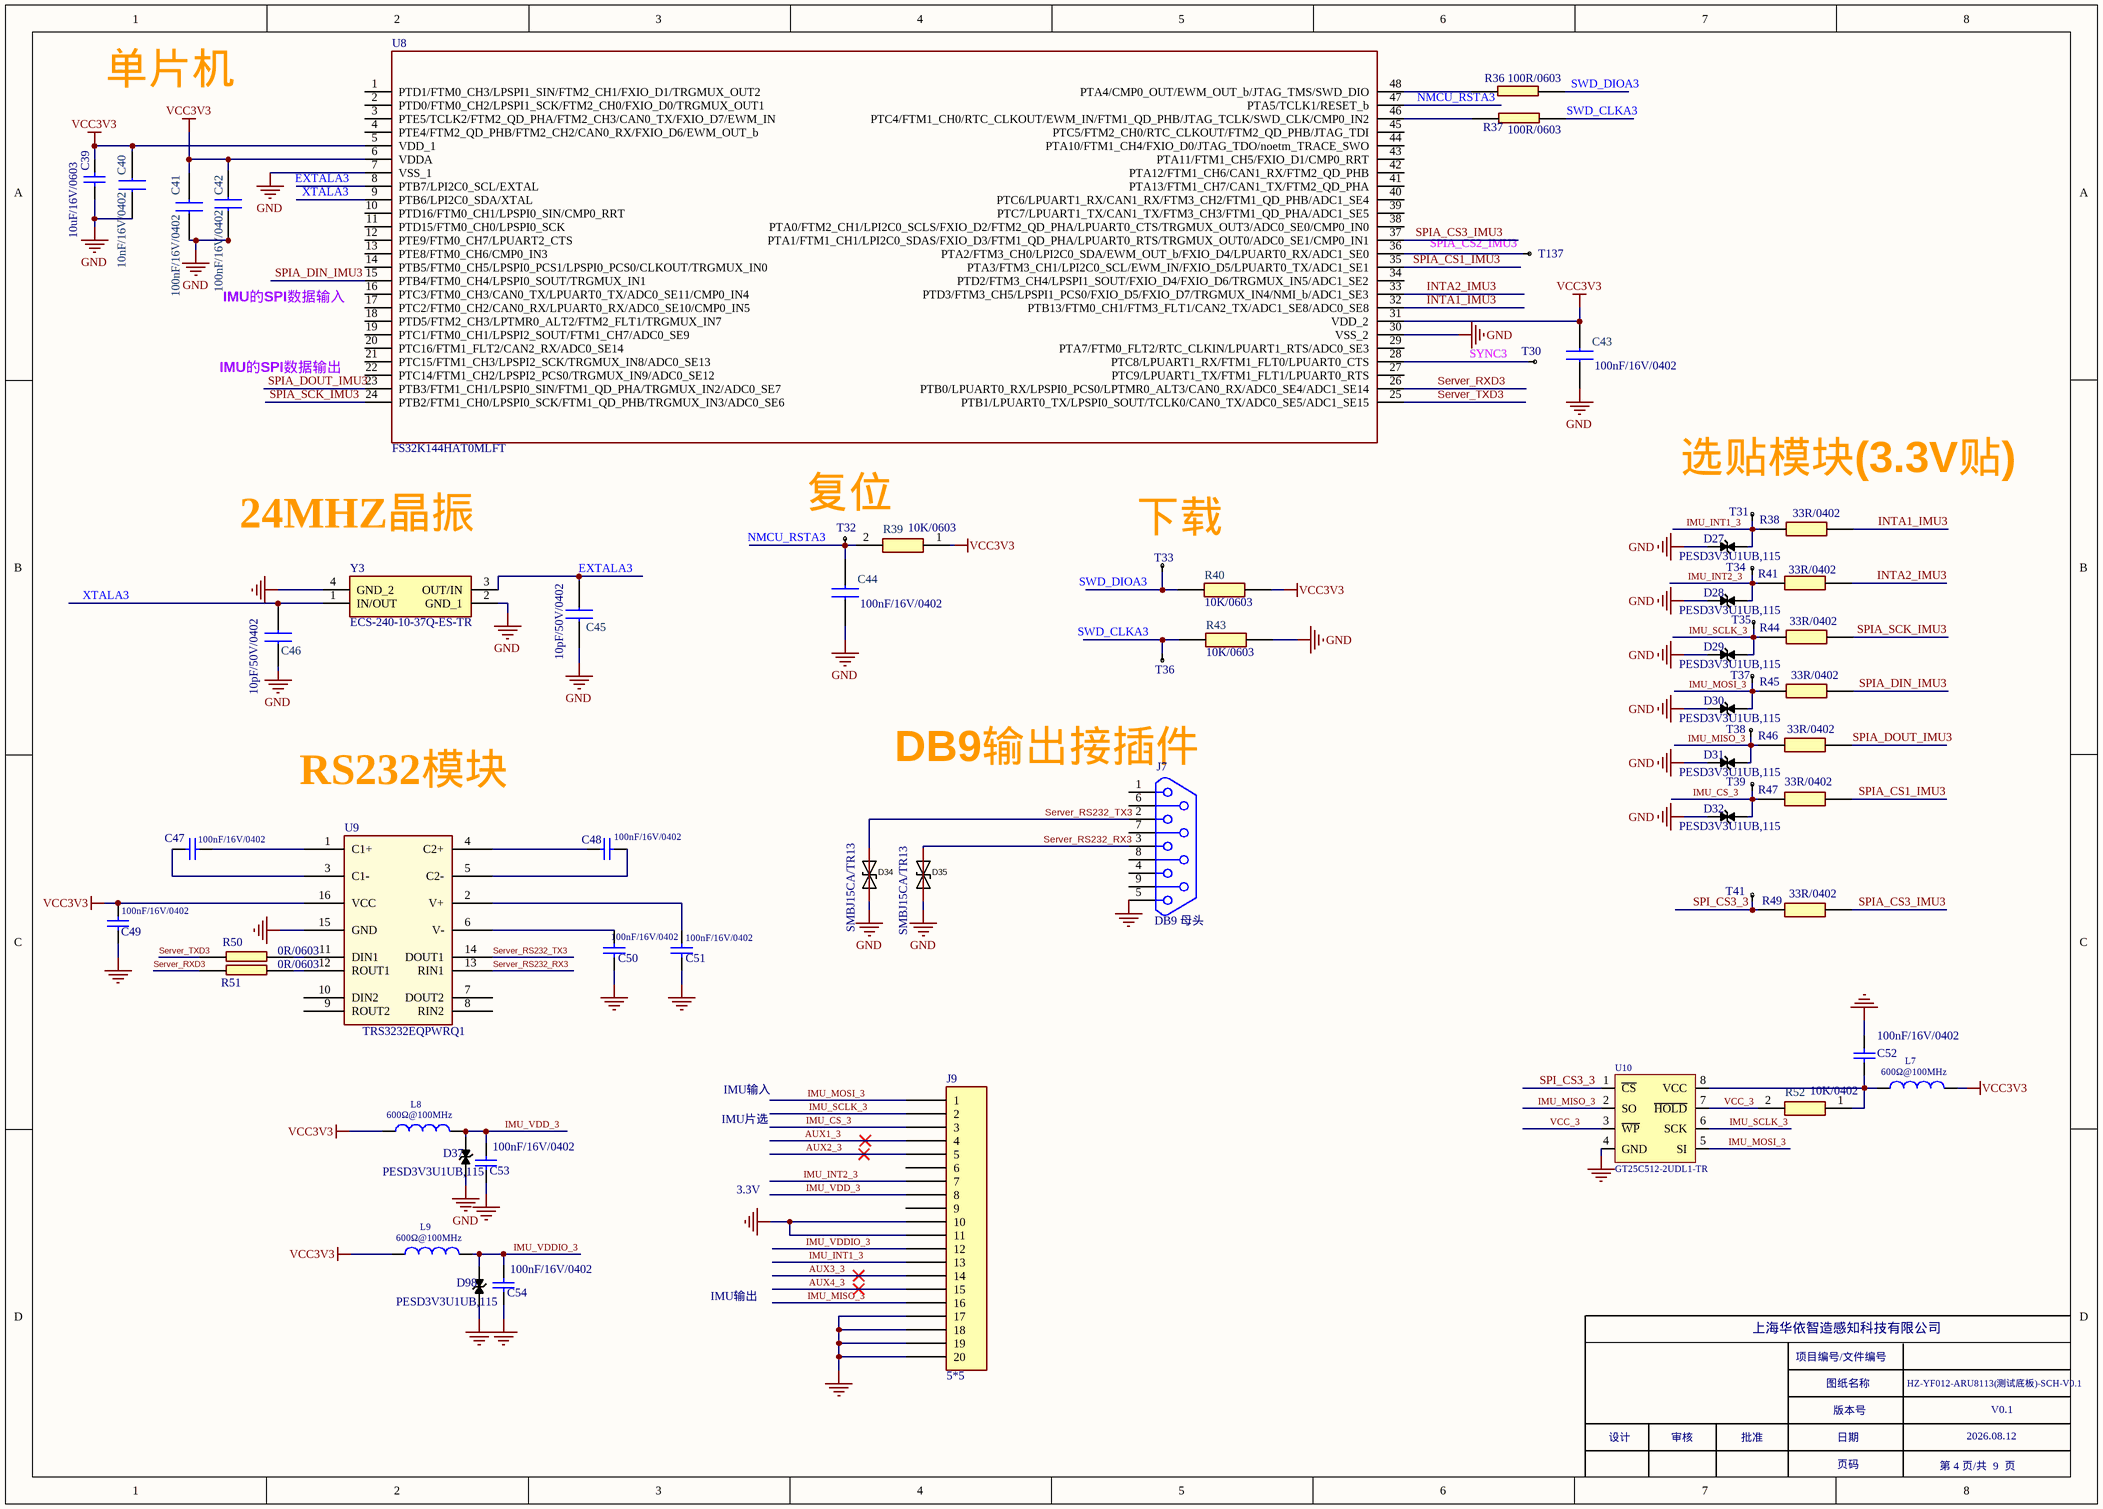
[diagram p3: 04_test3.SchDoc]

### Parts
C39  10uF/16V/0603  [C 0603_L]
C40  10nF/16V/0402  [C 0402_L]
C41  100nF/16V/0402  [C 0402_L]
C42  100nF/16V/0402  [C 0402_L]
C43  100nF/16V/0402  [C 0402_L]
C44  100nF/16V/0402  [C 0402_L]
C45  10pF/50V/0402  [C 0402_L]
C46  10pF/50V/0402  [C 0402_L]
C47  value 100nF/16V/0402  [C 0402_L]  (hidden comment: Cap)
C48  value 100nF/16V/0402  [C 0402_L]  (hidden comment: Cap)
C49  value 100nF/16V/0402  [C 0402_L]  (hidden comment: Cap)
C50  value 100nF/16V/0402  [C 0402_L]  (hidden comment: Cap)
C51  value 100nF/16V/0402  [C 0402_L]  (hidden comment: Cap)
C52  100nF/16V/0402  [0402C]
C53  100nF/16V/0402  [C 0402_L]
C54  100nF/16V/0402  [C 0402_L]
D27  PESD3V3U1UB,115  [SOD-523]
D28  PESD3V3U1UB,115  [SOD-523]
D29  PESD3V3U1UB,115  [SOD-523]
D30  PESD3V3U1UB,115  [SOD-523]
D31  PESD3V3U1UB,115  [SOD-523]
D32  PESD3V3U1UB,115  [SOD-523]
D34  SMBJ15CA/TR13  [SMB]
D35  SMBJ15CA/TR13  [SMB]
D37  PESD3V3U1UB,115  [PESD3V3U1UB,115]
D98  PESD3V3U1UB,115  [PESD3V3U1UB,115]
J7  DB9 母头  [DB9-RS8R1-2R77]
J9  5*5  [5*5-socket]
L7  value 600Ω@100MHz  [0603L]  (hidden comment: Inductor)
L8  value 600Ω@100MHz  [0603L]  (hidden comment: Inductor)
L9  value 600Ω@100MHz  [0603L]  (hidden comment: Inductor)
R36  100R/0603  [R 0603_L]
R37  100R/0603  [R 0603_L]
R38  33R/0402  [0402R]
R39  10K/0603  [R 0603_L]
R40  10K/0603  [R 0603_L]
R41  33R/0402  [0402R]
R43  10K/0603  [0603R]
R44  33R/0402  [0402R]
R45  33R/0402  [0402R]
R46  33R/0402  [0402R]
R47  33R/0402  [0402R]
R49  33R/0402  [0402R]
R50  0R/0603  [R 0603_L]
R51  0R/0603  [R 0603_L]
R52  10K/0402  [0402R]
T30  TEST  [Test-0.5mm]  (value not drawn)
T31  TEST  [TEST]  (value not drawn)
T32  TEST  [TEST]  (value not drawn)
T33  TEST  [TEST]  (value not drawn)
T34  TEST  [TEST]  (value not drawn)
T35  TEST  [TEST]  (value not drawn)
T36  TEST  [TEST]  (value not drawn)
T37  TEST  [TEST]  (value not drawn)
T38  TEST  [TEST]  (value not drawn)
T39  TEST  [TEST]  (value not drawn)
T41  TEST  [Test-0.5mm]  (value not drawn)
T137  TEST  [Test-0.5mm]  (value not drawn)
U8  FS32K144HAT0MLFT  [LQFP48_7X7]
U9  TRS3232EQPWRQ1  [TSSOP16_640X500]
U10  GT25C512-2UDL1-TR  [GT25C512-2UDLA2-TR]
Y3  ECS-240-10-37Q-ES-TR  [ECS2401037QESTR]

### Nets
GND: C39.2 C40.1 C41.2 C42.2 C43.2 C44.2 C45.1 C46.1 C49.2 C50.2 C51.2 C52.1 C53.2 C54.2 D27.1 D28.1 D29.1 D30.1 D31.1 D32.1 D34.1 D35.1 D37.1 D98.1 J7.5 J9.10 J9.11 J9.17 J9.18 J9.19 J9.20 R43.1 U8.7(VSS_1) U8.30(VSS_2) U9.15(GND) U10.4(GND) Y3.2(GND_1) Y3.4(GND_2)
VCC3V3: C39.1 C40.2 C41.1 C42.1 C43.1 C49.1 L7.2 L8.1 L9.1 R39.1 R40.1 U8.5(VDD_1) U8.6(VDDA) U8.31(VDD_2) U9.16(VCC)
AUX1_3: J9.4
AUX2_3: J9.5
AUX3_3: J9.14
AUX4_3: J9.15
EXTALA3: C45.2 U8.8(PTB7/LPI2C0_SCL/EXTAL) Y3.3(OUT/IN)
IMU_CS_3: D32.2 J9.3 R47.2 T39.1
IMU_INT1_3: D27.2 J9.13 R38.2 T31.1
IMU_INT2_3: D28.2 J9.7 R41.2 T34.1
IMU_MISO_3: D31.2 J9.16 R46.2 T38.1 U10.2(SO)
IMU_MOSI_3: D30.2 J9.1 R45.2 T37.1 U10.5(SI)
IMU_SCLK_3: D29.2 J9.2 R44.2 T35.1 U10.6(SCK)
IMU_VDD_3: C53.1 D37.2 J9.8 L8.2
IMU_VDDIO_3: C54.1 D98.2 J9.12 L9.2
INTA1_IMU3: R38.1 U8.32(PTB13/FTM0_CH1/FTM3_FLT1/CAN2_TX/ADC1_SE8/ADC0_SE8)
INTA2_IMU3: R41.1 U8.33(PTD3/FTM3_CH5/LPSPI1_PCS0/FXIO_D5/FXIO_D7/TRGMUX_IN4/NMI_b/ADC1_SE3)
NMCU_RSTA3: C44.1 R39.2 T32.1 U8.47(PTA5/TCLK1/RESET_b)
Server_RS232_RX3: D35.2 J7.3 U9.13(RIN1)
Server_RS232_TX3: D34.2 J7.2 U9.14(DOUT1)
Server_RXD3: R51.1 U8.26(PTB0/LPUART0_RX/LPSPI0_PCS0/LPTMR0_ALT3/CAN0_RX/ADC0_SE4/ADC1_SE14)
Server_TXD3: R50.1 U8.25(PTB1/LPUART0_TX/LPSPI0_SOUT/TCLK0/CAN0_TX/ADC0_SE5/ADC1_SE15)
SPI_CS3_3: R49.2 T41.1 U10.1(~{CS})
SPIA_CS1_IMU3: R47.1 U8.35(PTA3/FTM3_CH1/LPI2C0_SCL/EWM_IN/FXIO_D5/LPUART0_TX/ADC1_SE1)
SPIA_CS3_IMU3: R49.1 U8.37(PTA1/FTM1_CH1/LPI2C0_SDAS/FXIO_D3/FTM1_QD_PHA/LPUART0_RTS/TRGMUX_OUT0/ADC0_SE1/CMP0_IN1)
SPIA_DIN_IMU3: R45.1 U8.15(PTB4/FTM0_CH4/LPSPI0_SOUT/TRGMUX_IN1)
SPIA_DOUT_IMU3: R46.1 U8.23(PTB3/FTM1_CH1/LPSPI0_SIN/FTM1_QD_PHA/TRGMUX_IN2/ADC0_SE7)
SPIA_SCK_IMU3: R44.1 U8.24(PTB2/FTM1_CH0/LPSPI0_SCK/FTM1_QD_PHB/TRGMUX_IN3/ADC0_SE6)
SWD_CLKA3: R37.2 R43.2 T36.1
SWD_DIOA3: R36.2 R40.2 T33.1
SYNC3: T30.1 U8.28(PTC8/LPUART1_RX/FTM1_FLT0/LPUART0_CTS)
VCC_3: R52.2 U10.3(~{WP}) U10.7(~{HOLD})
XTALA3: C46.2 U8.9(PTB6/LPI2C0_SDA/XTAL) Y3.1(IN/OUT)
NetC47_1: C47.1 U9.3(C1-)
NetC47_2: C47.2 U9.1(C1+)
NetC48_1: C48.1 U9.4(C2+)
NetC48_2: C48.2 U9.5(C2-)
NetC50_1: C50.1 U9.6(V-)
NetC51_1: C51.1 U9.2(V+)
NetC52_2: C52.2 L7.1 R52.1 U10.8(VCC)
NetR36_1: R36.1 U8.48(PTA4/CMP0_OUT/EWM_OUT_b/JTAG_TMS/SWD_DIO)
NetR37_1: R37.1 U8.46(PTC4/FTM1_CH0/RTC_CLKOUT/EWM_IN/FTM1_QD_PHB/JTAG_TCLK/SWD_CLK/CMP0_IN2)
NetR50_2: R50.2 U9.11(DIN1)
NetR51_2: R51.2 U9.12(ROUT1)
NetT137_1: T137.1 U8.36(PTA2/FTM3_CH0/LPI2C0_SDA/EWM_OUT_b/FXIO_D4/LPUART0_RX/ADC1_SE0)

Not connected (* = marked no-connect by the designer): J7 1 4 6 7 8 9; J9 6 9; U8 1(PTD1/FTM0_CH3/LPSPI1_SIN/FTM2_CH1/FXIO_D1/TRGMUX_OUT2) 2(PTD0/FTM0_CH2/LPSPI1_SCK/FTM2_CH0/FXIO_D0/TRGMUX_OUT1) 3(PTE5/TCLK2/FTM2_QD_PHA/FTM2_CH3/CAN0_TX/FXIO_D7/EWM_IN) 4(PTE4/FTM2_QD_PHB/FTM2_CH2/CAN0_RX/FXIO_D6/EWM_OUT_b) 10(PTD16/FTM0_CH1/LPSPI0_SIN/CMP0_RRT) 11(PTD15/FTM0_CH0/LPSPI0_SCK) 12(PTE9/FTM0_CH7/LPUART2_CTS) 13(PTE8/FTM0_CH6/CMP0_IN3) 14(PTB5/FTM0_CH5/LPSPI0_PCS1/LPSPI0_PCS0/CLKOUT/TRGMUX_IN0) 16(PTC3/FTM0_CH3/CAN0_TX/LPUART0_TX/ADC0_SE11/CMP0_IN4) 17(PTC2/FTM0_CH2/CAN0_RX/LPUART0_RX/ADC0_SE10/CMP0_IN5) 18(PTD5/FTM2_CH3/LPTMR0_ALT2/FTM2_FLT1/TRGMUX_IN7) 19(PTC1/FTM0_CH1/LPSPI2_SOUT/FTM1_CH7/ADC0_SE9) 20(PTC16/FTM1_FLT2/CAN2_RX/ADC0_SE14) 21(PTC15/FTM1_CH3/LPSPI2_SCK/TRGMUX_IN8/ADC0_SE13) 22(PTC14/FTM1_CH2/LPSPI2_PCS0/TRGMUX_IN9/ADC0_SE12) 27(PTC9/LPUART1_TX/FTM1_FLT1/LPUART0_RTS) 29(PTA7/FTM0_FLT2/RTC_CLKIN/LPUART1_RTS/ADC0_SE3) 34(PTD2/FTM3_CH4/LPSPI1_SOUT/FXIO_D4/FXIO_D6/TRGMUX_IN5/ADC1_SE2) 38(PTA0/FTM2_CH1/LPI2C0_SCLS/FXIO_D2/FTM2_QD_PHA/LPUART0_CTS/TRGMUX_OUT3/ADC0_SE0/CMP0_IN0) 39(PTC7/LPUART1_TX/CAN1_TX/FTM3_CH3/FTM1_QD_PHA/ADC1_SE5) 40(PTC6/LPUART1_RX/CAN1_RX/FTM3_CH2/FTM1_QD_PHB/ADC1_SE4) 41(PTA13/FTM1_CH7/CAN1_TX/FTM2_QD_PHA) 42(PTA12/FTM1_CH6/CAN1_RX/FTM2_QD_PHB) 43(PTA11/FTM1_CH5/FXIO_D1/CMP0_RRT) 44(PTA10/FTM1_CH4/FXIO_D0/JTAG_TDO/noetm_TRACE_SWO) 45(PTC5/FTM2_CH0/RTC_CLKOUT/FTM2_QD_PHB/JTAG_TDI); U9 7(DOUT2) 8(RIN2) 9(ROUT2) 10(DIN2)

### Notes on the sheet
- 单片机
- IMU的SPI数据输入
- IMU的SPI数据输出
- (near T32) 复位
- 选贴模块(3.3V贴)
- (near Y3) 24MHZ晶振
- (near T33) 下载
- DB9输出接插件
- (near U9) RS232模块
- IMU片选
- IMU输入
- 3.3V
- IMU输出
- 上海华依智造感知科技有限公司
- 项目编号/文件编号
- 图纸名称
- HZ-YF012-ARU8113(测试底板)-SCH-V0.1
- 设计
- 审核
- 批准
- 版本号
- 日期
- 2026.08.12
- V0.1
- 页码
- 第 4 页/共  9  页
- Labels drawn without touching a wire or pin: SPIA_CS2_IMU3

### Library data of the parts
C39 = Cap: SMD/SMT 10UF 16V 20% 0603; Published: 8-Jun-2000; LatestRevisionDate: 17-Jul-2002; LatestRevisionNote: Re-released for DXP Platform.; PackageReference: RAD-0.3; Publisher: Altium Limited; PackageDescription: Radial Cap, Thru-Hole; 2 Leads; 0.3 in Pin Spacing; Value: 10uF/16V
C40-C46 = 0402Capacitor: as C22 on sheet 01_POWER ; Datasheet Link: https://componentsearchengine.com//GCM155R71C104KA55D.pdf; Height: 0.55mm; Mouser2 Part Number: 81-GCM155R71C104KA5D; Mouser2 Price/Stock: https://www.mouser.com/Search/Refine.aspx?Keyword=81-GCM155R71C104KA5D
C47-C54 = Cap: as C9 on sheet 02_test1; Published: 8-Jun-2000; LatestRevisionDate: 17-Jul-2002; LatestRevisionNote: Re-released for DXP Platform.; PackageReference: RAD-0.3; Publisher: Altium Limited; PackageDescription: Radial Cap, Thru-Hole; 2 Leads; 0.3 in Pin Spacing
  C52-C54: Value: 100nF/16V/0402
D27-D32 D37 D98 = SMBJ36CA: as D1 on sheet 02_test1
D34 D35 = SMBJ15CA/TR13_C78410: as D8 on sheet 02_test1; Device: SMBJ15CA/TR13_C78410; LCSC Part Name: 双向 15V截止 24.6A峰值脉冲; Supplier Part: C78410; Manufacturer Part: SMBJ15CA/TR13; Supplier Footprint: SMB(DO-214AA); JLCPCB Part Class: Extended Part; Datasheet: https://atta.szlcsc.com/upload/public/pdf/source/20181127/C309995_EB3DFB9F9AEE5D2146ECD9FA5992A402.pdf; Supplier: LCSC; Convert to PCB: yes
J7 = DB9
L7-L9 = Inductor: Code_IEC: 1005; Published: 8-Jun-2000; LatestRevisionDate: 29-May-2009; LatestRevisionNote: IPC-7351 Footprint Added.; PackageReference: 0402-A; Publisher: Altium Limited; PackageDescription: Chip Inductor; Code_JEITA: 0402
R36 R37 R50 R51 = 0402
R38-R41 R43-R47 R49 R52 = 0402Resistor: as R18 on sheet 01_POWER ; Datasheet Link: https://www.mouser.fr/datasheet/2/219/RN73H-12200.pdf; Height: 0.4mm
U8 = FS32K144HAT0MLFT: as U1 on sheet 02_test1; Datasheet Link: http://www.nxp.com/docs/en/data-sheet/S32K-DS.pdf; Height: 1.6mm; Manufacturer_Part_Number: FS32K144HAT0MLFT
U10 = GT25C512-2UDLA2-TR
Y3 = ECS-240-10-37Q-ES-TR: as Y1 on sheet 02_test1; Datasheet Link: https://www.ecsxtal.com/store/pdf/ECX-1637Q.pdf; Height: 0.55mm; Manufacturer_Part_Number: ECS-240-10-37Q-ES-TR

## Sheet 05_test4.SchDoc
size A3
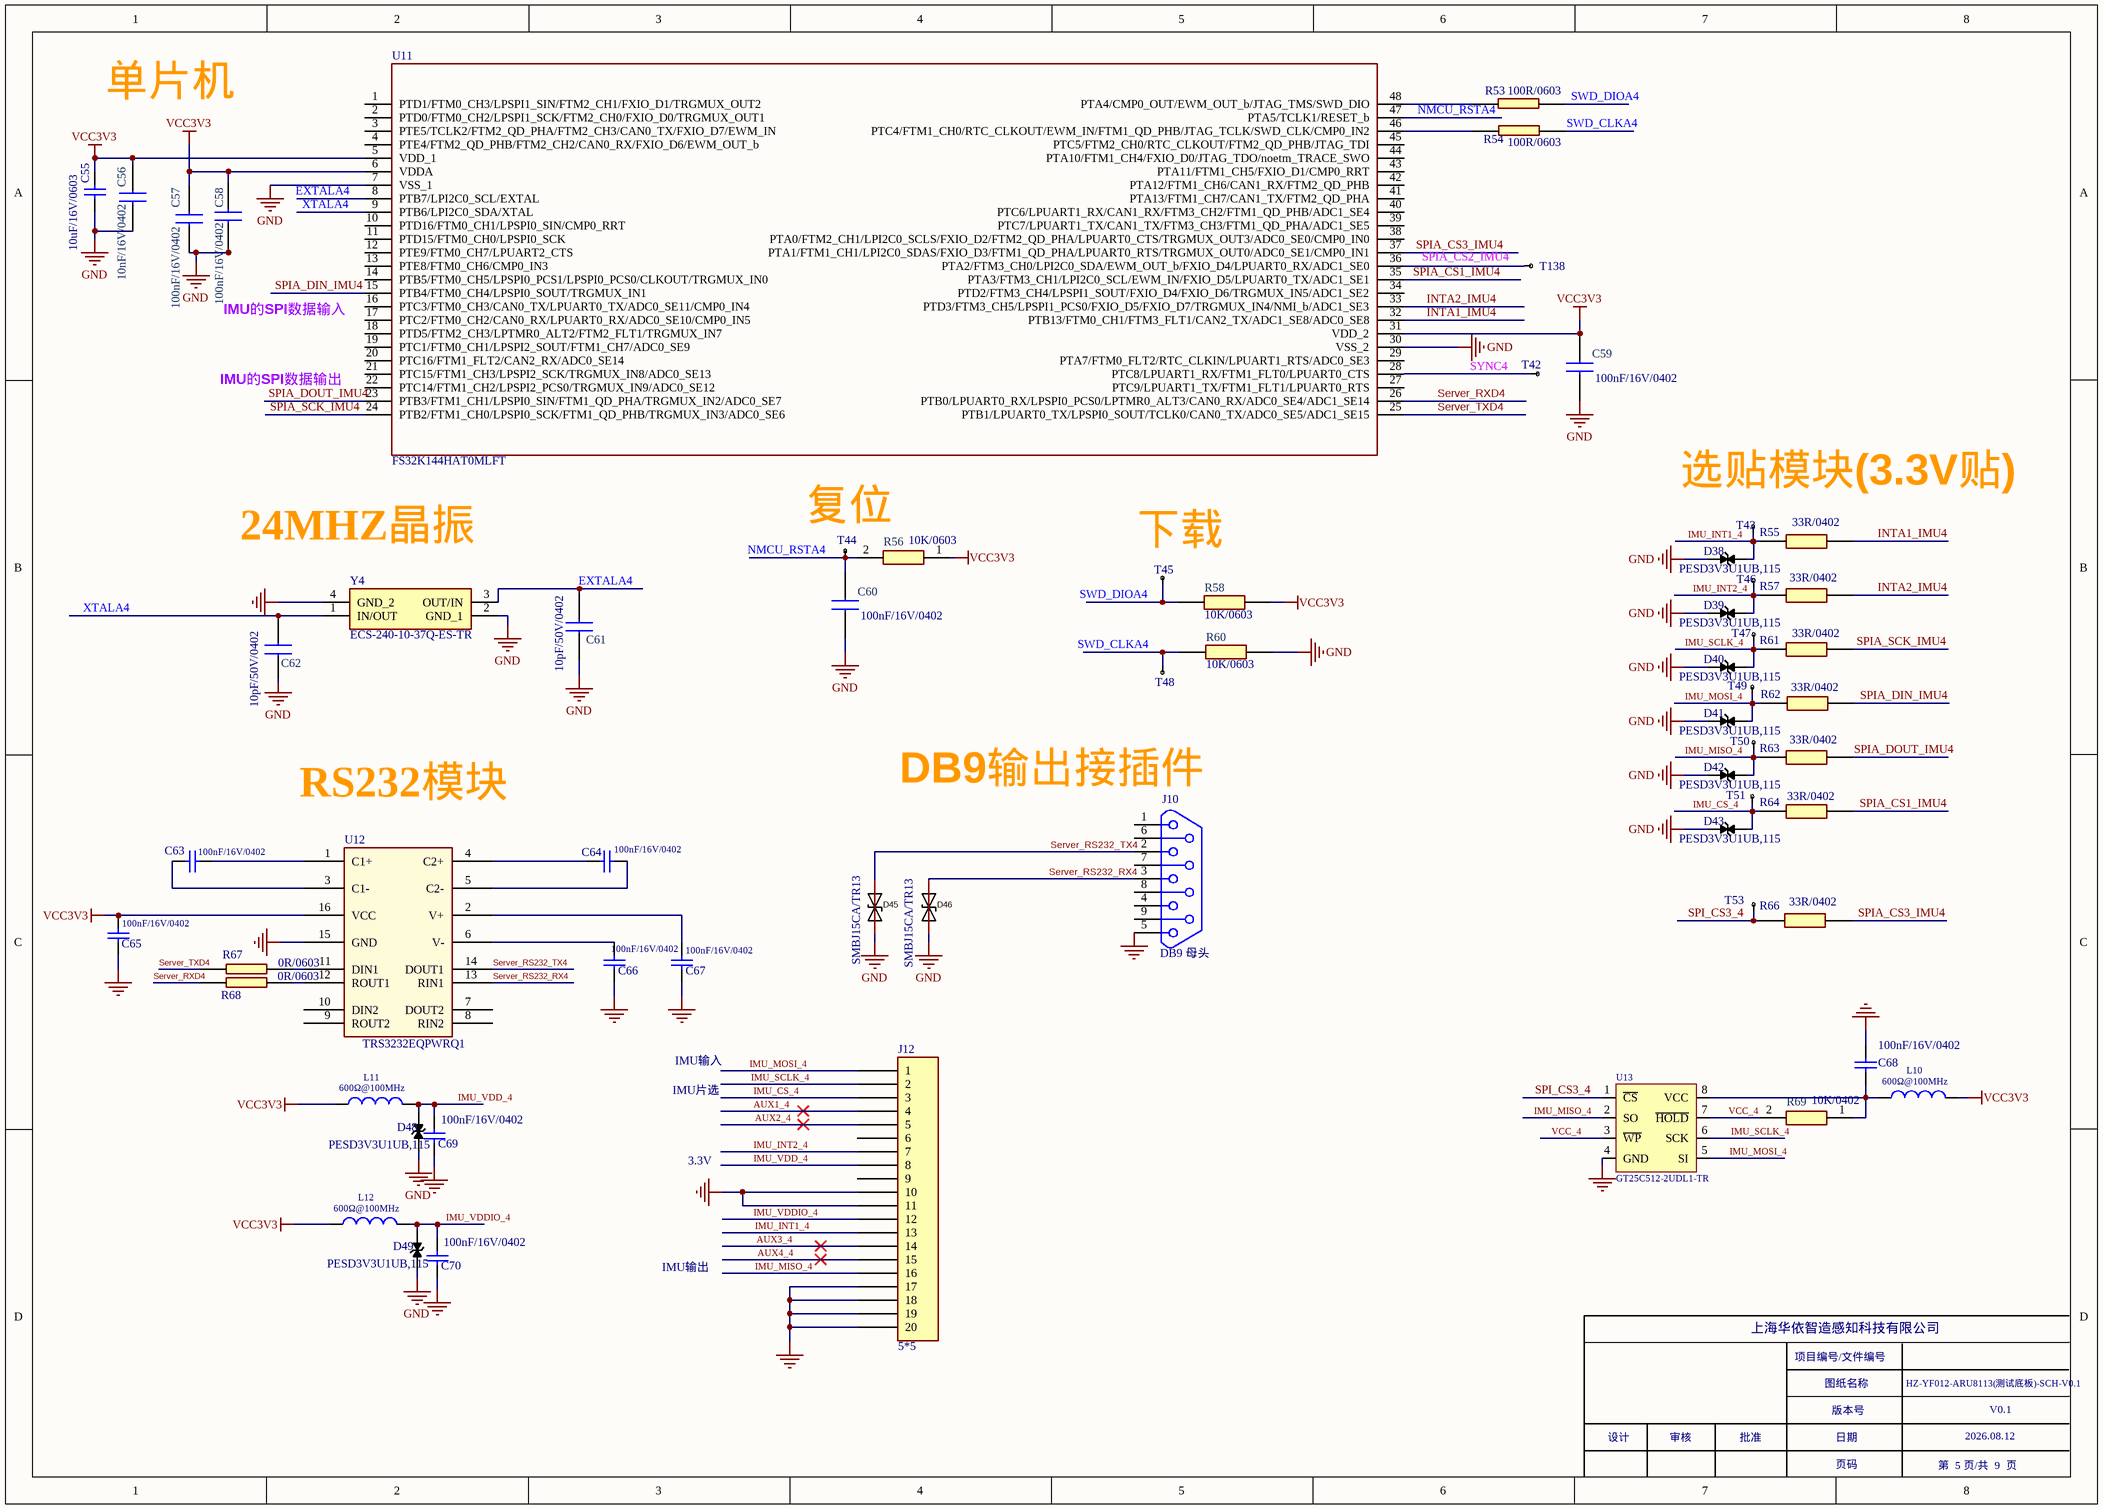
[diagram p4: 05_test4.SchDoc]

### Parts
C55  10uF/16V/0603  [C 0603_L]
C56  10nF/16V/0402  [C 0402_L]
C57  100nF/16V/0402  [C 0402_L]
C58  100nF/16V/0402  [C 0402_L]
C59  100nF/16V/0402  [C 0402_L]
C60  100nF/16V/0402  [C 0402_L]
C61  10pF/50V/0402  [C 0402_L]
C62  10pF/50V/0402  [C 0402_L]
C63  value 100nF/16V/0402  [C 0402_L]  (hidden comment: Cap)
C64  value 100nF/16V/0402  [C 0402_L]  (hidden comment: Cap)
C65  value 100nF/16V/0402  [C 0402_L]  (hidden comment: Cap)
C66  value 100nF/16V/0402  [C 0402_L]  (hidden comment: Cap)
C67  value 100nF/16V/0402  [C 0402_L]  (hidden comment: Cap)
C68  100nF/16V/0402  [C 0402_L]
C69  100nF/16V/0402  [C 0402_L]
C70  100nF/16V/0402  [0402C]
D38  PESD3V3U1UB,115  [SOD-523]
D39  PESD3V3U1UB,115  [SOD-523]
D40  PESD3V3U1UB,115  [SOD-523]
D41  PESD3V3U1UB,115  [SOD-523]
D42  PESD3V3U1UB,115  [SOD-523]
D43  PESD3V3U1UB,115  [SOD-523]
D45  SMBJ15CA/TR13  [SMB]
D46  SMBJ15CA/TR13  [SMB]
D48  PESD3V3U1UB,115  [PESD3V3U1UB,115]
D49  PESD3V3U1UB,115  [SOD-523]
J10  DB9 母头  [DB9-RS8R1-2R77]
J12  5*5  [5*5-socket]
L10  value 600Ω@100MHz  [0603L]  (hidden comment: Inductor)
L11  value 600Ω@100MHz  [0603L]  (hidden comment: Inductor)
L12  value 600Ω@100MHz  [0603L]  (hidden comment: Inductor)
R53  100R/0603  [R 0603_L]
R54  100R/0603  [R 0603_L]
R55  33R/0402  [0402R]
R56  10K/0603  [R 0603_L]
R57  33R/0402  [0402R]
R58  10K/0603  [R 0603_L]
R60  10K/0603  [0603R]
R61  33R/0402  [0402R]
R62  33R/0402  [0402R]
R63  33R/0402  [0402R]
R64  33R/0402  [0402R]
R66  33R/0402  [0402R]
R67  0R/0603  [R 0603_L]
R68  0R/0603  [R 0603_L]
R69  10K/0402  [0402R]
T42  TEST  [Test-0.5mm]  (value not drawn)
T43  TEST  [TEST]  (value not drawn)
T44  TEST  [TEST]  (value not drawn)
T45  TEST  [TEST]  (value not drawn)
T46  TEST  [TEST]  (value not drawn)
T47  TEST  [TEST]  (value not drawn)
T48  TEST  [TEST]  (value not drawn)
T49  TEST  [TEST]  (value not drawn)
T50  TEST  [TEST]  (value not drawn)
T51  TEST  [TEST]  (value not drawn)
T53  TEST  [TEST]  (value not drawn)
T138  TEST  [Test-0.5mm]  (value not drawn)
U11  FS32K144HAT0MLFT  [LQFP48_7X7]
U12  TRS3232EQPWRQ1  [TSSOP16_640X500]
U13  GT25C512-2UDL1-TR  [GT25C512-2UDLA2-TR]
Y4  ECS-240-10-37Q-ES-TR  [ECS2401037QESTR]

### Nets
GND: C55.2 C56.1 C57.2 C58.2 C59.2 C60.2 C61.1 C62.1 C65.2 C66.2 C67.2 C68.1 C69.2 C70.2 D38.1 D39.1 D40.1 D41.1 D42.1 D43.1 D45.1 D46.1 D48.1 D49.1 J10.5 J12.10 J12.11 J12.17 J12.18 J12.19 J12.20 R60.1 U11.7(VSS_1) U11.30(VSS_2) U12.15(GND) U13.4(GND) Y4.2(GND_1) Y4.4(GND_2)
VCC3V3: C55.1 C56.2 C57.1 C58.1 C59.1 C65.1 L10.2 L11.1 L12.1 R56.1 R58.1 U11.5(VDD_1) U11.6(VDDA) U11.31(VDD_2) U12.16(VCC)
AUX1_4: J12.4
AUX2_4: J12.5
AUX3_4: J12.14
AUX4_4: J12.15
EXTALA4: C61.2 U11.8(PTB7/LPI2C0_SCL/EXTAL) Y4.3(OUT/IN)
IMU_CS_4: D43.2 J12.3 R64.2 T51.1
IMU_INT1_4: D38.2 J12.13 R55.2 T43.1
IMU_INT2_4: D39.2 J12.7 R57.2 T46.1
IMU_MISO_4: D42.2 J12.16 R63.2 T50.1 U13.2(SO)
IMU_MOSI_4: D41.2 J12.1 R62.2 T49.1 U13.5(SI)
IMU_SCLK_4: D40.2 J12.2 R61.2 T47.1 U13.6(SCK)
IMU_VDD_4: C69.1 D48.2 J12.8 L11.2
IMU_VDDIO_4: C70.1 D49.2 J12.12 L12.2
INTA1_IMU4: R55.1 U11.32(PTB13/FTM0_CH1/FTM3_FLT1/CAN2_TX/ADC1_SE8/ADC0_SE8)
INTA2_IMU4: R57.1 U11.33(PTD3/FTM3_CH5/LPSPI1_PCS0/FXIO_D5/FXIO_D7/TRGMUX_IN4/NMI_b/ADC1_SE3)
NMCU_RSTA4: C60.1 R56.2 T44.1 U11.47(PTA5/TCLK1/RESET_b)
Server_RS232_RX4: D46.2 J10.3 U12.13(RIN1)
Server_RS232_TX4: D45.2 J10.2 U12.14(DOUT1)
Server_RXD4: R68.1 U11.26(PTB0/LPUART0_RX/LPSPI0_PCS0/LPTMR0_ALT3/CAN0_RX/ADC0_SE4/ADC1_SE14)
Server_TXD4: R67.1 U11.25(PTB1/LPUART0_TX/LPSPI0_SOUT/TCLK0/CAN0_TX/ADC0_SE5/ADC1_SE15)
SPI_CS3_4: R66.2 T53.1 U13.1(~{CS})
SPIA_CS1_IMU4: R64.1 U11.35(PTA3/FTM3_CH1/LPI2C0_SCL/EWM_IN/FXIO_D5/LPUART0_TX/ADC1_SE1)
SPIA_CS3_IMU4: R66.1 U11.37(PTA1/FTM1_CH1/LPI2C0_SDAS/FXIO_D3/FTM1_QD_PHA/LPUART0_RTS/TRGMUX_OUT0/ADC0_SE1/CMP0_IN1)
SPIA_DIN_IMU4: R62.1 U11.15(PTB4/FTM0_CH4/LPSPI0_SOUT/TRGMUX_IN1)
SPIA_DOUT_IMU4: R63.1 U11.23(PTB3/FTM1_CH1/LPSPI0_SIN/FTM1_QD_PHA/TRGMUX_IN2/ADC0_SE7)
SPIA_SCK_IMU4: R61.1 U11.24(PTB2/FTM1_CH0/LPSPI0_SCK/FTM1_QD_PHB/TRGMUX_IN3/ADC0_SE6)
SWD_CLKA4: R54.2 R60.2 T48.1
SWD_DIOA4: R53.2 R58.2 T45.1
SYNC4: T42.1 U11.28(PTC8/LPUART1_RX/FTM1_FLT0/LPUART0_CTS)
VCC_4: R69.2 U13.3(~{WP}) U13.7(~{HOLD})
XTALA4: C62.2 U11.9(PTB6/LPI2C0_SDA/XTAL) Y4.1(IN/OUT)
NetC63_1: C63.1 U12.3(C1-)
NetC63_2: C63.2 U12.1(C1+)
NetC64_1: C64.1 U12.4(C2+)
NetC64_2: C64.2 U12.5(C2-)
NetC66_1: C66.1 U12.6(V-)
NetC67_1: C67.1 U12.2(V+)
NetC68_2: C68.2 L10.1 R69.1 U13.8(VCC)
NetR53_1: R53.1 U11.48(PTA4/CMP0_OUT/EWM_OUT_b/JTAG_TMS/SWD_DIO)
NetR54_1: R54.1 U11.46(PTC4/FTM1_CH0/RTC_CLKOUT/EWM_IN/FTM1_QD_PHB/JTAG_TCLK/SWD_CLK/CMP0_IN2)
NetR67_2: R67.2 U12.11(DIN1)
NetR68_2: R68.2 U12.12(ROUT1)
NetT138_1: T138.1 U11.36(PTA2/FTM3_CH0/LPI2C0_SDA/EWM_OUT_b/FXIO_D4/LPUART0_RX/ADC1_SE0)

Not connected (* = marked no-connect by the designer): J10 1 4 6 7 8 9; J12 6 9; U11 1(PTD1/FTM0_CH3/LPSPI1_SIN/FTM2_CH1/FXIO_D1/TRGMUX_OUT2) 2(PTD0/FTM0_CH2/LPSPI1_SCK/FTM2_CH0/FXIO_D0/TRGMUX_OUT1) 3(PTE5/TCLK2/FTM2_QD_PHA/FTM2_CH3/CAN0_TX/FXIO_D7/EWM_IN) 4(PTE4/FTM2_QD_PHB/FTM2_CH2/CAN0_RX/FXIO_D6/EWM_OUT_b) 10(PTD16/FTM0_CH1/LPSPI0_SIN/CMP0_RRT) 11(PTD15/FTM0_CH0/LPSPI0_SCK) 12(PTE9/FTM0_CH7/LPUART2_CTS) 13(PTE8/FTM0_CH6/CMP0_IN3) 14(PTB5/FTM0_CH5/LPSPI0_PCS1/LPSPI0_PCS0/CLKOUT/TRGMUX_IN0) 16(PTC3/FTM0_CH3/CAN0_TX/LPUART0_TX/ADC0_SE11/CMP0_IN4) 17(PTC2/FTM0_CH2/CAN0_RX/LPUART0_RX/ADC0_SE10/CMP0_IN5) 18(PTD5/FTM2_CH3/LPTMR0_ALT2/FTM2_FLT1/TRGMUX_IN7) 19(PTC1/FTM0_CH1/LPSPI2_SOUT/FTM1_CH7/ADC0_SE9) 20(PTC16/FTM1_FLT2/CAN2_RX/ADC0_SE14) 21(PTC15/FTM1_CH3/LPSPI2_SCK/TRGMUX_IN8/ADC0_SE13) 22(PTC14/FTM1_CH2/LPSPI2_PCS0/TRGMUX_IN9/ADC0_SE12) 27(PTC9/LPUART1_TX/FTM1_FLT1/LPUART0_RTS) 29(PTA7/FTM0_FLT2/RTC_CLKIN/LPUART1_RTS/ADC0_SE3) 34(PTD2/FTM3_CH4/LPSPI1_SOUT/FXIO_D4/FXIO_D6/TRGMUX_IN5/ADC1_SE2) 38(PTA0/FTM2_CH1/LPI2C0_SCLS/FXIO_D2/FTM2_QD_PHA/LPUART0_CTS/TRGMUX_OUT3/ADC0_SE0/CMP0_IN0) 39(PTC7/LPUART1_TX/CAN1_TX/FTM3_CH3/FTM1_QD_PHA/ADC1_SE5) 40(PTC6/LPUART1_RX/CAN1_RX/FTM3_CH2/FTM1_QD_PHB/ADC1_SE4) 41(PTA13/FTM1_CH7/CAN1_TX/FTM2_QD_PHA) 42(PTA12/FTM1_CH6/CAN1_RX/FTM2_QD_PHB) 43(PTA11/FTM1_CH5/FXIO_D1/CMP0_RRT) 44(PTA10/FTM1_CH4/FXIO_D0/JTAG_TDO/noetm_TRACE_SWO) 45(PTC5/FTM2_CH0/RTC_CLKOUT/FTM2_QD_PHB/JTAG_TDI); U12 7(DOUT2) 8(RIN2) 9(ROUT2) 10(DIN2)

### Notes on the sheet
- 单片机
- IMU的SPI数据输入
- IMU的SPI数据输出
- 选贴模块(3.3V贴)
- (near Y4) 24MHZ晶振
- (near T44) 复位
- (near T45) 下载
- DB9输出接插件
- (near U12) RS232模块
- IMU片选
- IMU输入
- 3.3V
- IMU输出
- 上海华依智造感知科技有限公司
- 项目编号/文件编号
- 图纸名称
- HZ-YF012-ARU8113(测试底板)-SCH-V0.1
- 设计
- 审核
- 批准
- 版本号
- 日期
- 2026.08.12
- V0.1
- 页码
- 第  5 页/共  9  页
- Labels drawn without touching a wire or pin: SPIA_CS2_IMU4

### Library data of the parts
C55 = Cap: SMD/SMT 10UF 16V 20% 0603; Published: 8-Jun-2000; LatestRevisionDate: 17-Jul-2002; LatestRevisionNote: Re-released for DXP Platform.; PackageReference: RAD-0.3; Publisher: Altium Limited; PackageDescription: Radial Cap, Thru-Hole; 2 Leads; 0.3 in Pin Spacing; Value: 10uF/16V
C56-C62 = 0402Capacitor: as C22 on sheet 01_POWER ; Datasheet Link: https://componentsearchengine.com//GCM155R71C104KA55D.pdf; Height: 0.55mm; Mouser2 Part Number: 81-GCM155R71C104KA5D; Mouser2 Price/Stock: https://www.mouser.com/Search/Refine.aspx?Keyword=81-GCM155R71C104KA5D
C63-C70 = Cap: as C9 on sheet 02_test1; Published: 8-Jun-2000; LatestRevisionDate: 17-Jul-2002; LatestRevisionNote: Re-released for DXP Platform.; PackageReference: RAD-0.3; Publisher: Altium Limited; PackageDescription: Radial Cap, Thru-Hole; 2 Leads; 0.3 in Pin Spacing
  C68-C70: Value: 100nF/16V/0402
D38-D43 D48 D49 = SMBJ36CA: as D1 on sheet 02_test1
D45 D46 = SMBJ15CA/TR13_C78410: as D8 on sheet 02_test1; Device: SMBJ15CA/TR13_C78410; LCSC Part Name: 双向 15V截止 24.6A峰值脉冲; Supplier Part: C78410; Manufacturer Part: SMBJ15CA/TR13; Supplier Footprint: SMB(DO-214AA); JLCPCB Part Class: Extended Part; Datasheet: https://atta.szlcsc.com/upload/public/pdf/source/20181127/C309995_EB3DFB9F9AEE5D2146ECD9FA5992A402.pdf; Supplier: LCSC; Convert to PCB: yes
J10 = DB9
L10-L12 = Inductor: Code_IEC: 1005; Published: 8-Jun-2000; LatestRevisionDate: 29-May-2009; LatestRevisionNote: IPC-7351 Footprint Added.; PackageReference: 0402-A; Publisher: Altium Limited; PackageDescription: Chip Inductor; Code_JEITA: 0402
R53 R54 R67 R68 = 0402
R55-R58 R60-R64 R66 R69 = 0402Resistor: as R18 on sheet 01_POWER ; Datasheet Link: https://www.mouser.fr/datasheet/2/219/RN73H-12200.pdf; Height: 0.4mm
U11 = FS32K144HAT0MLFT: as U1 on sheet 02_test1; Datasheet Link: http://www.nxp.com/docs/en/data-sheet/S32K-DS.pdf; Height: 1.6mm; Manufacturer_Part_Number: FS32K144HAT0MLFT
U13 = GT25C512-2UDLA2-TR
Y4 = ECS-240-10-37Q-ES-TR: as Y1 on sheet 02_test1; Datasheet Link: https://www.ecsxtal.com/store/pdf/ECX-1637Q.pdf; Height: 0.55mm; Manufacturer_Part_Number: ECS-240-10-37Q-ES-TR

## Sheet 06_test5.SchDoc
size A3
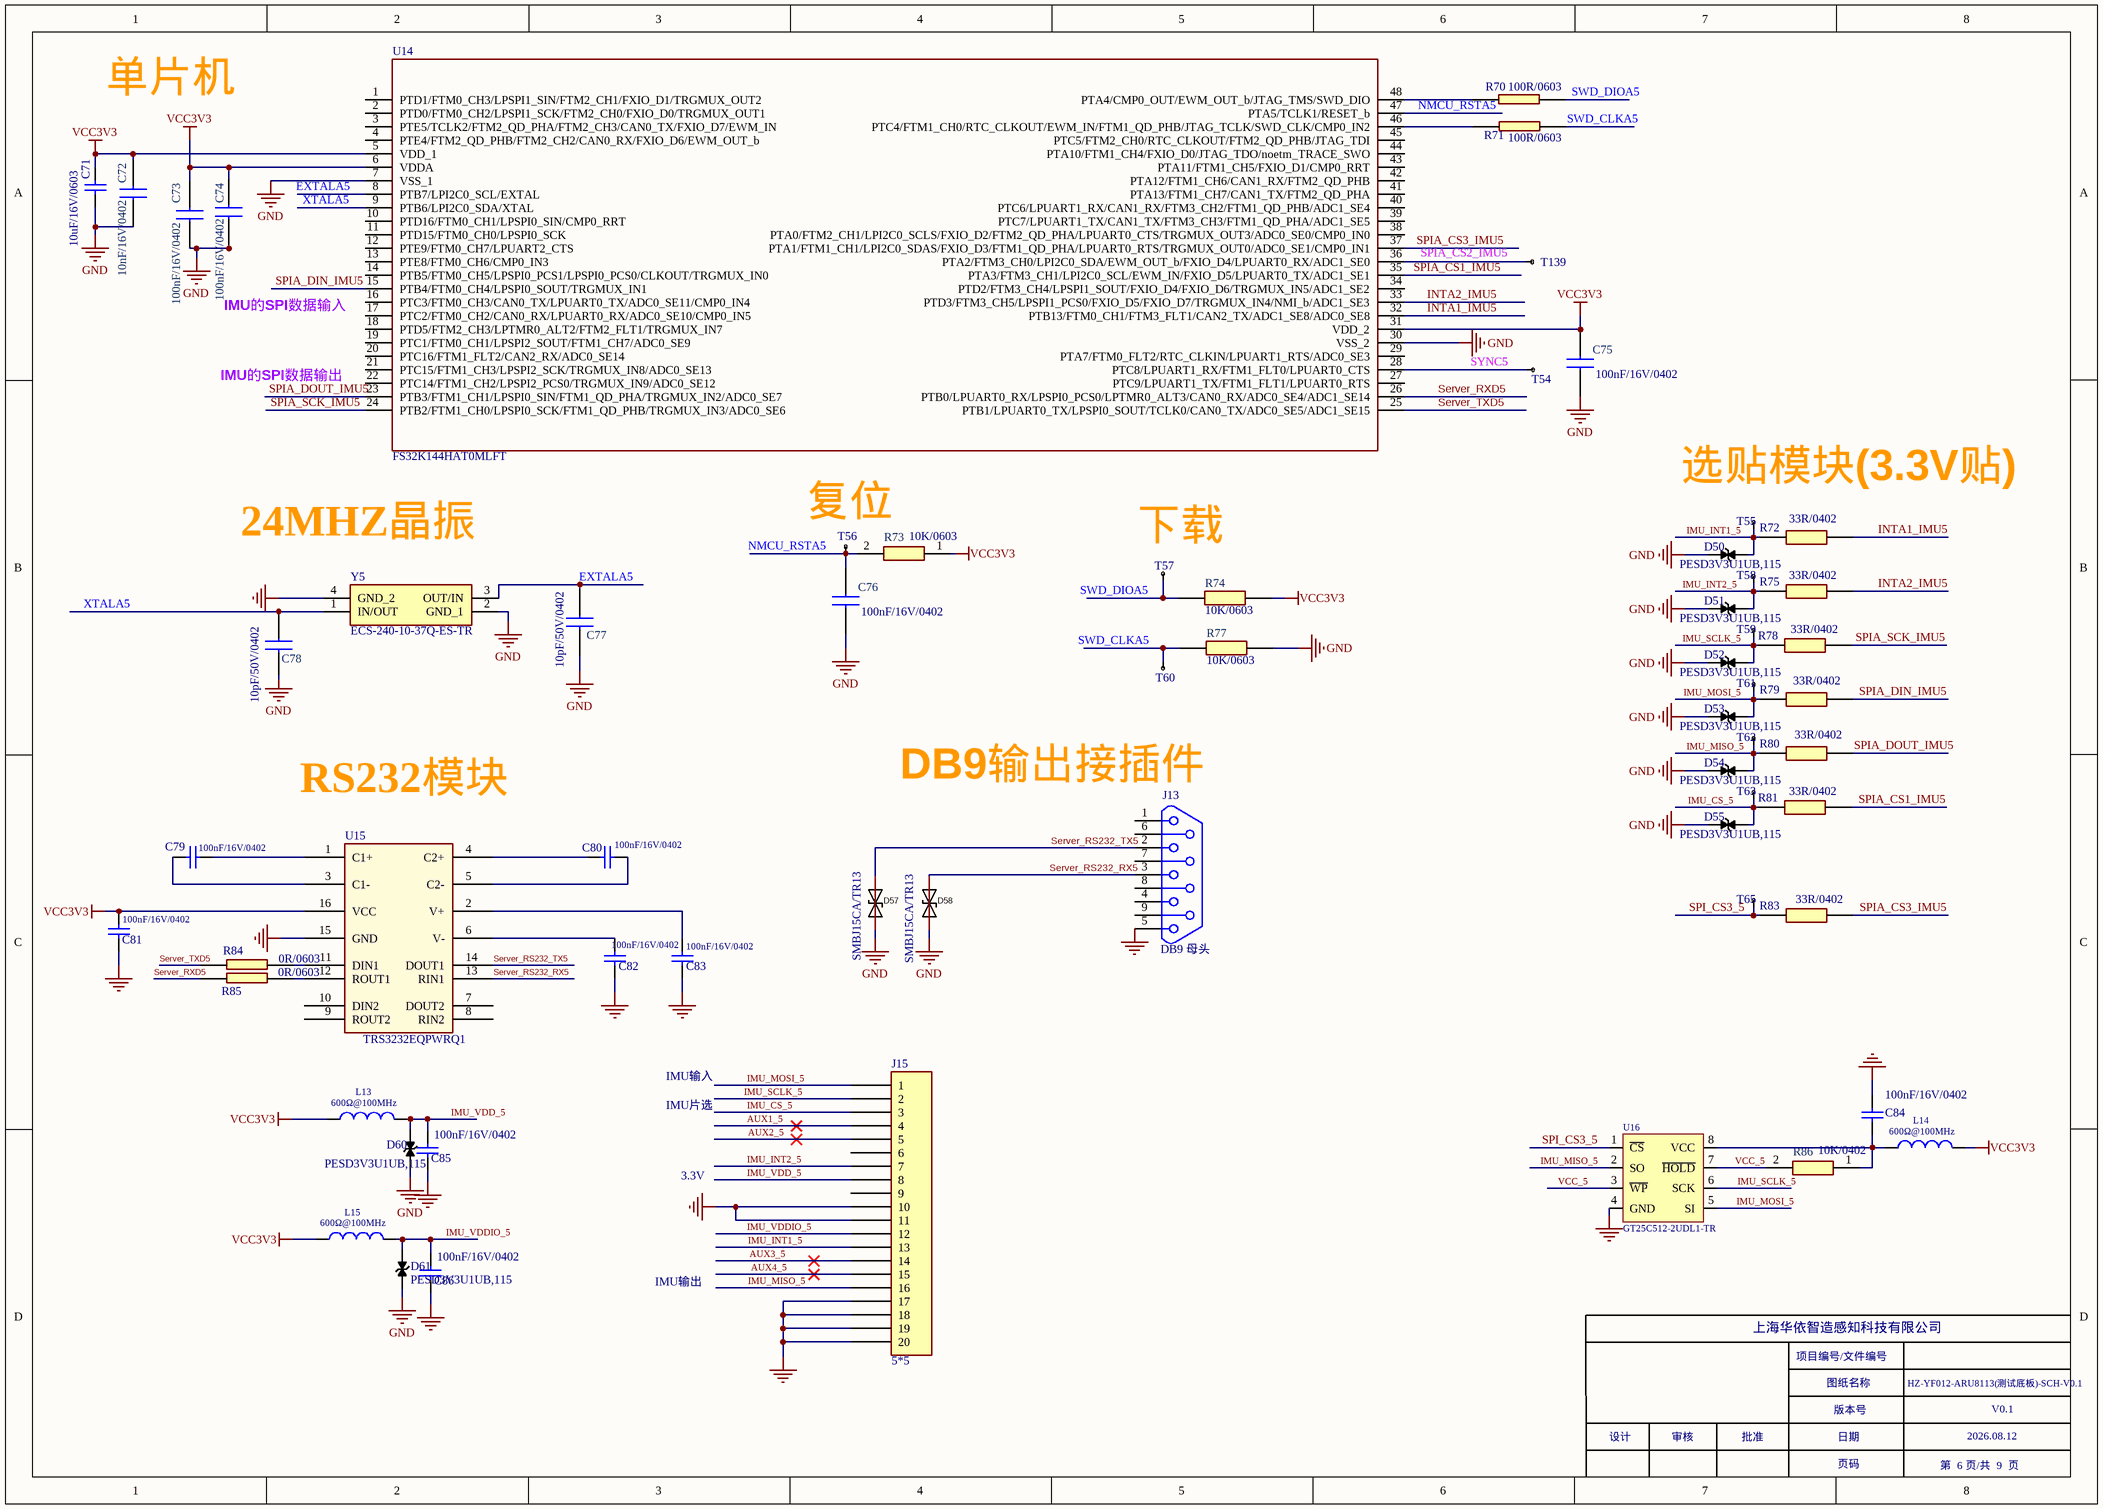
[diagram p5: 06_test5.SchDoc]

### Parts
C71  10uF/16V/0603  [C 0603_L]
C72  10nF/16V/0402  [C 0402_L]
C73  100nF/16V/0402  [C 0402_L]
C74  100nF/16V/0402  [C 0402_L]
C75  100nF/16V/0402  [C 0402_L]
C76  100nF/16V/0402  [C 0402_L]
C77  10pF/50V/0402  [C 0402_L]
C78  10pF/50V/0402  [C 0402_L]
C79  value 100nF/16V/0402  [C 0402_L]  (hidden comment: Cap)
C80  value 100nF/16V/0402  [C 0402_L]  (hidden comment: Cap)
C81  value 100nF/16V/0402  [C 0402_L]  (hidden comment: Cap)
C82  value 100nF/16V/0402  [C 0402_L]  (hidden comment: Cap)
C83  value 100nF/16V/0402  [C 0402_L]  (hidden comment: Cap)
C84  100nF/16V/0402  [C 0402_L]
C85  100nF/16V/0402  [C 0402_L]
C86  100nF/16V/0402  [0402C]
D50  PESD3V3U1UB,115  [SOD-523]
D51  PESD3V3U1UB,115  [SOD-523]
D52  PESD3V3U1UB,115  [SOD-523]
D53  PESD3V3U1UB,115  [SOD-523]
D54  PESD3V3U1UB,115  [SOD-523]
D55  PESD3V3U1UB,115  [SOD-523]
D57  SMBJ15CA/TR13  [SMB]
D58  SMBJ15CA/TR13  [SMB]
D60  PESD3V3U1UB,115  [PESD3V3U1UB,115]
D61  PESD3V3U1UB,115  [PESD3V3U1UB,115]
J13  DB9 母头  [DB9-RS8R1-2R77]
J15  5*5  [5*5-socket]
L13  value 600Ω@100MHz  [0603L]  (hidden comment: Inductor)
L14  value 600Ω@100MHz  [0603L]  (hidden comment: Inductor)
L15  value 600Ω@100MHz  [0603L]  (hidden comment: Inductor)
R70  100R/0603  [R 0603_L]
R71  100R/0603  [R 0603_L]
R72  33R/0402  [0402R]
R73  10K/0603  [R 0603_L]
R74  10K/0603  [R 0603_L]
R75  33R/0402  [0402R]
R77  10K/0603  [R 0603_L]
R78  33R/0402  [0402R]
R79  33R/0402  [0402R]
R80  33R/0402  [0402R]
R81  33R/0402  [0402R]
R83  33R/0402  [0402R]
R84  0R/0603  [R 0603_L]
R85  0R/0603  [R 0603_L]
R86  10K/0402  [0402R]
T54  TEST  [Test-0.5mm]  (value not drawn)
T55  TEST  [TEST]  (value not drawn)
T56  TEST  [TEST]  (value not drawn)
T57  TEST  [TEST]  (value not drawn)
T58  TEST  [TEST]  (value not drawn)
T59  TEST  [TEST]  (value not drawn)
T60  TEST  [TEST]  (value not drawn)
T61  TEST  [TEST]  (value not drawn)
T62  TEST  [TEST]  (value not drawn)
T63  TEST  [TEST]  (value not drawn)
T65  TEST  [TEST]  (value not drawn)
T139  TEST  [Test-0.5mm]  (value not drawn)
U14  FS32K144HAT0MLFT  [LQFP48_7X7]
U15  TRS3232EQPWRQ1  [TSSOP16_640X500]
U16  GT25C512-2UDL1-TR  [GT25C512-2UDLA2-TR]
Y5  ECS-240-10-37Q-ES-TR  [ECS2401037QESTR]

### Nets
GND: C71.2 C72.1 C73.2 C74.2 C75.2 C76.2 C77.1 C78.1 C81.2 C82.2 C83.2 C84.1 C85.2 C86.2 D50.1 D51.1 D52.1 D53.1 D54.1 D55.1 D57.1 D58.1 D60.1 D61.1 J13.5 J15.10 J15.11 J15.17 J15.18 J15.19 J15.20 R77.1 U14.7(VSS_1) U14.30(VSS_2) U15.15(GND) U16.4(GND) Y5.2(GND_1) Y5.4(GND_2)
VCC3V3: C71.1 C72.2 C73.1 C74.1 C75.1 C81.1 L13.1 L14.2 L15.1 R73.1 R74.1 U14.5(VDD_1) U14.6(VDDA) U14.31(VDD_2) U15.16(VCC)
AUX1_5: J15.4
AUX2_5: J15.5
AUX3_5: J15.14
AUX4_5: J15.15
EXTALA5: C77.2 U14.8(PTB7/LPI2C0_SCL/EXTAL) Y5.3(OUT/IN)
IMU_CS_5: D55.2 J15.3 R81.2 T63.1
IMU_INT1_5: D50.2 J15.13 R72.2 T55.1
IMU_INT2_5: D51.2 J15.7 R75.2 T58.1
IMU_MISO_5: D54.2 J15.16 R80.2 T62.1 U16.2(SO)
IMU_MOSI_5: D53.2 J15.1 R79.2 T61.1 U16.5(SI)
IMU_SCLK_5: D52.2 J15.2 R78.2 T59.1 U16.6(SCK)
IMU_VDD_5: C85.1 D60.2 J15.8 L13.2
IMU_VDDIO_5: C86.1 D61.2 J15.12 L15.2
INTA1_IMU5: R72.1 U14.32(PTB13/FTM0_CH1/FTM3_FLT1/CAN2_TX/ADC1_SE8/ADC0_SE8)
INTA2_IMU5: R75.1 U14.33(PTD3/FTM3_CH5/LPSPI1_PCS0/FXIO_D5/FXIO_D7/TRGMUX_IN4/NMI_b/ADC1_SE3)
NMCU_RSTA5: C76.1 R73.2 T56.1 U14.47(PTA5/TCLK1/RESET_b)
Server_RS232_RX5: D58.2 J13.3 U15.13(RIN1)
Server_RS232_TX5: D57.2 J13.2 U15.14(DOUT1)
Server_RXD5: R85.1 U14.26(PTB0/LPUART0_RX/LPSPI0_PCS0/LPTMR0_ALT3/CAN0_RX/ADC0_SE4/ADC1_SE14)
Server_TXD5: R84.1 U14.25(PTB1/LPUART0_TX/LPSPI0_SOUT/TCLK0/CAN0_TX/ADC0_SE5/ADC1_SE15)
SPI_CS3_5: R83.2 T65.1 U16.1(~{CS})
SPIA_CS1_IMU5: R81.1 U14.35(PTA3/FTM3_CH1/LPI2C0_SCL/EWM_IN/FXIO_D5/LPUART0_TX/ADC1_SE1)
SPIA_CS3_IMU5: R83.1 U14.37(PTA1/FTM1_CH1/LPI2C0_SDAS/FXIO_D3/FTM1_QD_PHA/LPUART0_RTS/TRGMUX_OUT0/ADC0_SE1/CMP0_IN1)
SPIA_DIN_IMU5: R79.1 U14.15(PTB4/FTM0_CH4/LPSPI0_SOUT/TRGMUX_IN1)
SPIA_DOUT_IMU5: R80.1 U14.23(PTB3/FTM1_CH1/LPSPI0_SIN/FTM1_QD_PHA/TRGMUX_IN2/ADC0_SE7)
SPIA_SCK_IMU5: R78.1 U14.24(PTB2/FTM1_CH0/LPSPI0_SCK/FTM1_QD_PHB/TRGMUX_IN3/ADC0_SE6)
SWD_CLKA5: R71.2 R77.2 T60.1
SWD_DIOA5: R70.2 R74.2 T57.1
SYNC5: T54.1 U14.28(PTC8/LPUART1_RX/FTM1_FLT0/LPUART0_CTS)
VCC_5: R86.2 U16.3(~{WP}) U16.7(~{HOLD})
XTALA5: C78.2 U14.9(PTB6/LPI2C0_SDA/XTAL) Y5.1(IN/OUT)
NetC79_1: C79.1 U15.3(C1-)
NetC79_2: C79.2 U15.1(C1+)
NetC80_1: C80.1 U15.4(C2+)
NetC80_2: C80.2 U15.5(C2-)
NetC82_1: C82.1 U15.6(V-)
NetC83_1: C83.1 U15.2(V+)
NetC84_2: C84.2 L14.1 R86.1 U16.8(VCC)
NetR70_1: R70.1 U14.48(PTA4/CMP0_OUT/EWM_OUT_b/JTAG_TMS/SWD_DIO)
NetR71_1: R71.1 U14.46(PTC4/FTM1_CH0/RTC_CLKOUT/EWM_IN/FTM1_QD_PHB/JTAG_TCLK/SWD_CLK/CMP0_IN2)
NetR84_2: R84.2 U15.11(DIN1)
NetR85_2: R85.2 U15.12(ROUT1)
NetT139_1: T139.1 U14.36(PTA2/FTM3_CH0/LPI2C0_SDA/EWM_OUT_b/FXIO_D4/LPUART0_RX/ADC1_SE0)

Not connected (* = marked no-connect by the designer): J13 1 4 6 7 8 9; J15 6 9; U14 1(PTD1/FTM0_CH3/LPSPI1_SIN/FTM2_CH1/FXIO_D1/TRGMUX_OUT2) 2(PTD0/FTM0_CH2/LPSPI1_SCK/FTM2_CH0/FXIO_D0/TRGMUX_OUT1) 3(PTE5/TCLK2/FTM2_QD_PHA/FTM2_CH3/CAN0_TX/FXIO_D7/EWM_IN) 4(PTE4/FTM2_QD_PHB/FTM2_CH2/CAN0_RX/FXIO_D6/EWM_OUT_b) 10(PTD16/FTM0_CH1/LPSPI0_SIN/CMP0_RRT) 11(PTD15/FTM0_CH0/LPSPI0_SCK) 12(PTE9/FTM0_CH7/LPUART2_CTS) 13(PTE8/FTM0_CH6/CMP0_IN3) 14(PTB5/FTM0_CH5/LPSPI0_PCS1/LPSPI0_PCS0/CLKOUT/TRGMUX_IN0) 16(PTC3/FTM0_CH3/CAN0_TX/LPUART0_TX/ADC0_SE11/CMP0_IN4) 17(PTC2/FTM0_CH2/CAN0_RX/LPUART0_RX/ADC0_SE10/CMP0_IN5) 18(PTD5/FTM2_CH3/LPTMR0_ALT2/FTM2_FLT1/TRGMUX_IN7) 19(PTC1/FTM0_CH1/LPSPI2_SOUT/FTM1_CH7/ADC0_SE9) 20(PTC16/FTM1_FLT2/CAN2_RX/ADC0_SE14) 21(PTC15/FTM1_CH3/LPSPI2_SCK/TRGMUX_IN8/ADC0_SE13) 22(PTC14/FTM1_CH2/LPSPI2_PCS0/TRGMUX_IN9/ADC0_SE12) 27(PTC9/LPUART1_TX/FTM1_FLT1/LPUART0_RTS) 29(PTA7/FTM0_FLT2/RTC_CLKIN/LPUART1_RTS/ADC0_SE3) 34(PTD2/FTM3_CH4/LPSPI1_SOUT/FXIO_D4/FXIO_D6/TRGMUX_IN5/ADC1_SE2) 38(PTA0/FTM2_CH1/LPI2C0_SCLS/FXIO_D2/FTM2_QD_PHA/LPUART0_CTS/TRGMUX_OUT3/ADC0_SE0/CMP0_IN0) 39(PTC7/LPUART1_TX/CAN1_TX/FTM3_CH3/FTM1_QD_PHA/ADC1_SE5) 40(PTC6/LPUART1_RX/CAN1_RX/FTM3_CH2/FTM1_QD_PHB/ADC1_SE4) 41(PTA13/FTM1_CH7/CAN1_TX/FTM2_QD_PHA) 42(PTA12/FTM1_CH6/CAN1_RX/FTM2_QD_PHB) 43(PTA11/FTM1_CH5/FXIO_D1/CMP0_RRT) 44(PTA10/FTM1_CH4/FXIO_D0/JTAG_TDO/noetm_TRACE_SWO) 45(PTC5/FTM2_CH0/RTC_CLKOUT/FTM2_QD_PHB/JTAG_TDI); U15 7(DOUT2) 8(RIN2) 9(ROUT2) 10(DIN2)

### Notes on the sheet
- 单片机
- IMU的SPI数据输入
- IMU的SPI数据输出
- 选贴模块(3.3V贴)
- (near Y5) 24MHZ晶振
- (near T56) 复位
- (near T57) 下载
- DB9输出接插件
- (near U15) RS232模块
- IMU输入
- IMU片选
- 3.3V
- IMU输出
- 上海华依智造感知科技有限公司
- 项目编号/文件编号
- 图纸名称
- HZ-YF012-ARU8113(测试底板)-SCH-V0.1
- 设计
- 审核
- 批准
- 版本号
- 日期
- 2026.08.12
- V0.1
- 页码
- 第  6 页/共  9  页
- Labels drawn without touching a wire or pin: SPIA_CS2_IMU5

### Library data of the parts
C71 = Cap: SMD/SMT 10UF 16V 20% 0603; Published: 8-Jun-2000; LatestRevisionDate: 17-Jul-2002; LatestRevisionNote: Re-released for DXP Platform.; PackageReference: RAD-0.3; Publisher: Altium Limited; PackageDescription: Radial Cap, Thru-Hole; 2 Leads; 0.3 in Pin Spacing; Value: 10uF/16V
C72-C78 = 0402Capacitor: as C22 on sheet 01_POWER ; Datasheet Link: https://componentsearchengine.com//GCM155R71C104KA55D.pdf; Height: 0.55mm; Mouser2 Part Number: 81-GCM155R71C104KA5D; Mouser2 Price/Stock: https://www.mouser.com/Search/Refine.aspx?Keyword=81-GCM155R71C104KA5D
C79-C86 = Cap: as C9 on sheet 02_test1; Published: 8-Jun-2000; LatestRevisionDate: 17-Jul-2002; LatestRevisionNote: Re-released for DXP Platform.; PackageReference: RAD-0.3; Publisher: Altium Limited; PackageDescription: Radial Cap, Thru-Hole; 2 Leads; 0.3 in Pin Spacing
  C84-C86: Value: 100nF/16V/0402
D50-D55 D60 D61 = SMBJ36CA: as D1 on sheet 02_test1
D57 D58 = SMBJ15CA/TR13_C78410: as D8 on sheet 02_test1; Device: SMBJ15CA/TR13_C78410; LCSC Part Name: 双向 15V截止 24.6A峰值脉冲; Supplier Part: C78410; Manufacturer Part: SMBJ15CA/TR13; Supplier Footprint: SMB(DO-214AA); JLCPCB Part Class: Extended Part; Datasheet: https://atta.szlcsc.com/upload/public/pdf/source/20181127/C309995_EB3DFB9F9AEE5D2146ECD9FA5992A402.pdf; Supplier: LCSC; Convert to PCB: yes
J13 = DB9
L13-L15 = Inductor: Code_IEC: 1005; Published: 8-Jun-2000; LatestRevisionDate: 29-May-2009; LatestRevisionNote: IPC-7351 Footprint Added.; PackageReference: 0402-A; Publisher: Altium Limited; PackageDescription: Chip Inductor; Code_JEITA: 0402
R70 R71 R84 R85 = 0402
R72-R75 R77-R81 R83 R86 = 0402Resistor: as R18 on sheet 01_POWER ; Datasheet Link: https://www.mouser.fr/datasheet/2/219/RN73H-12200.pdf; Height: 0.4mm
U14 = FS32K144HAT0MLFT: as U1 on sheet 02_test1; Datasheet Link: http://www.nxp.com/docs/en/data-sheet/S32K-DS.pdf; Height: 1.6mm; Manufacturer_Part_Number: FS32K144HAT0MLFT
U16 = GT25C512-2UDLA2-TR
Y5 = ECS-240-10-37Q-ES-TR: as Y1 on sheet 02_test1; Datasheet Link: https://www.ecsxtal.com/store/pdf/ECX-1637Q.pdf; Height: 0.55mm; Manufacturer_Part_Number: ECS-240-10-37Q-ES-TR